# Altium project CM5_RP2040_MZM.PrjPcb (part 1 of 3)
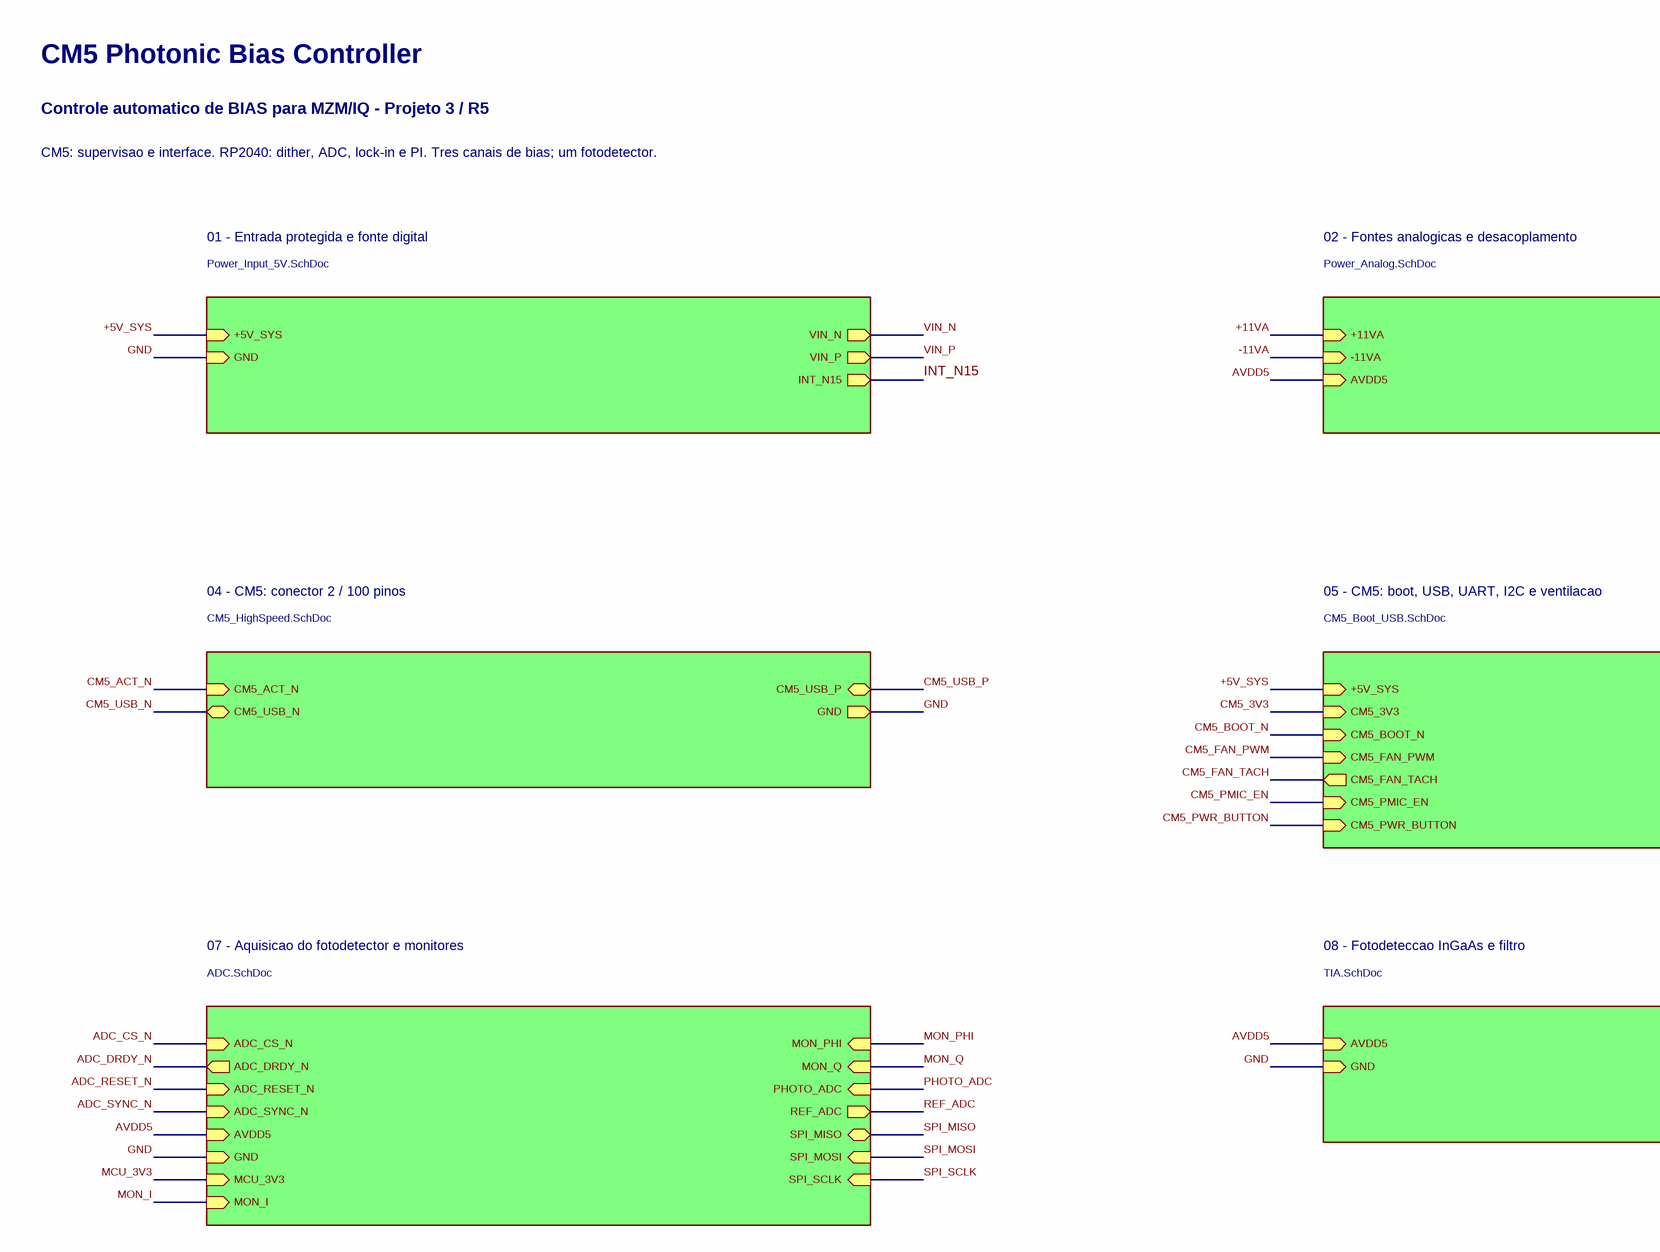
[diagram p0: Top_Level.SchDoc, top left]
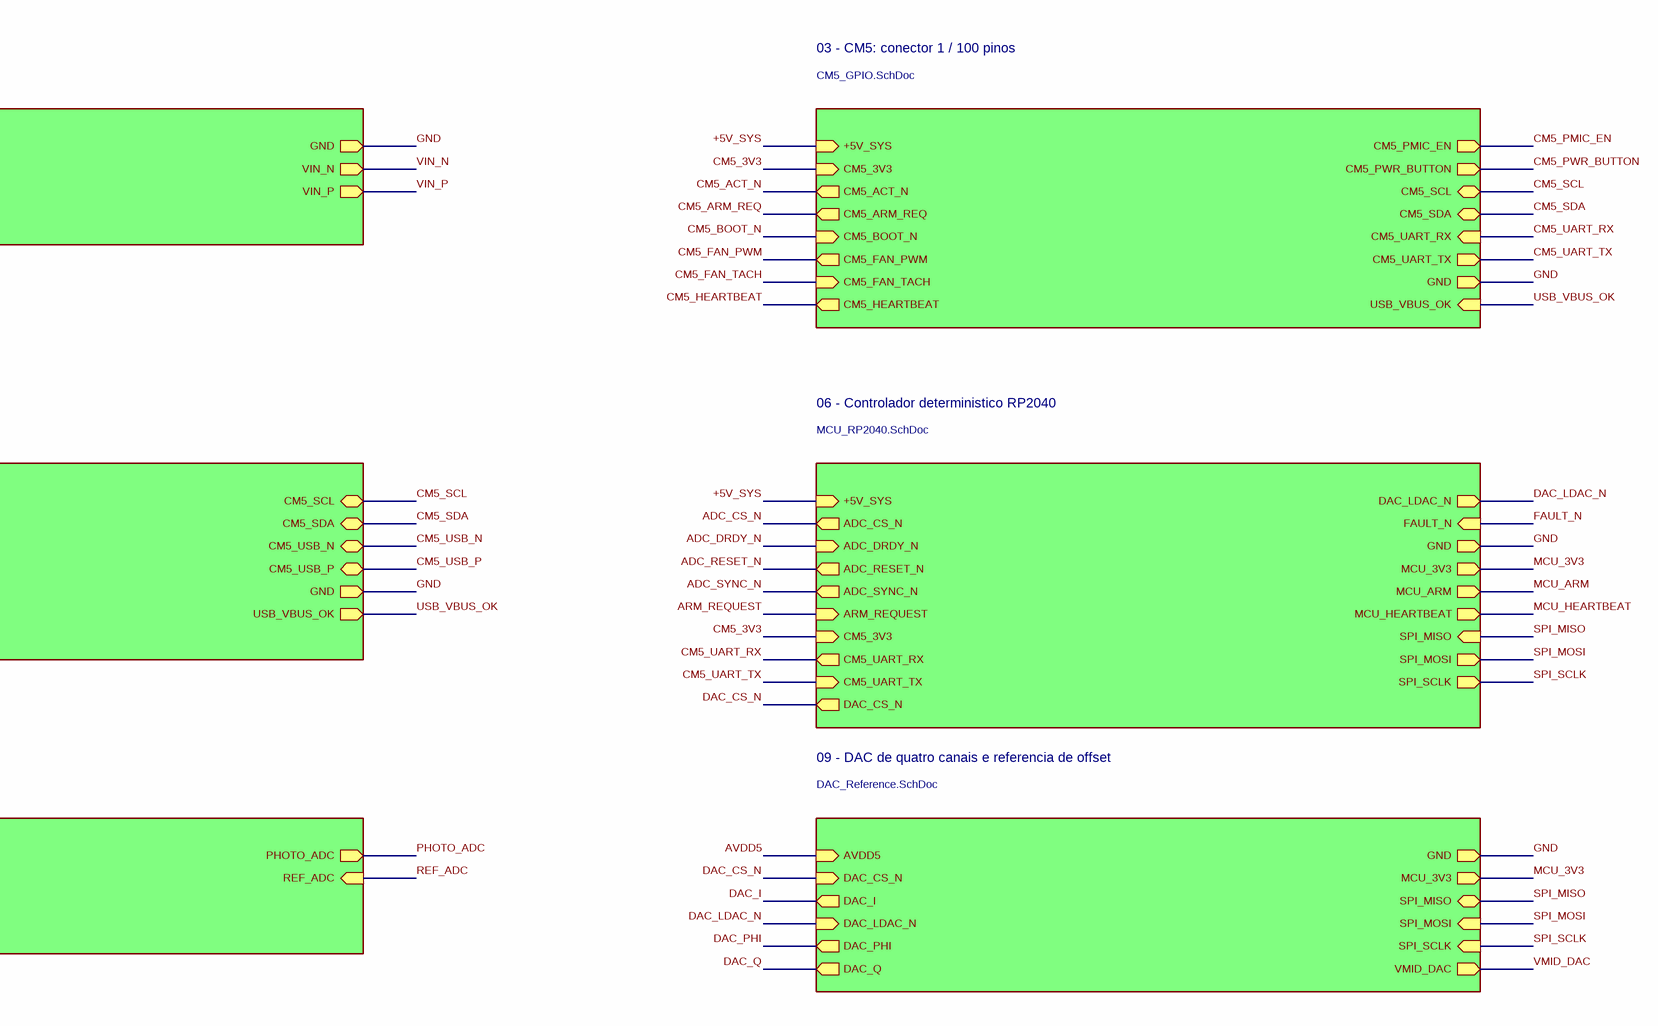
[diagram p1: Top_Level.SchDoc, top right]
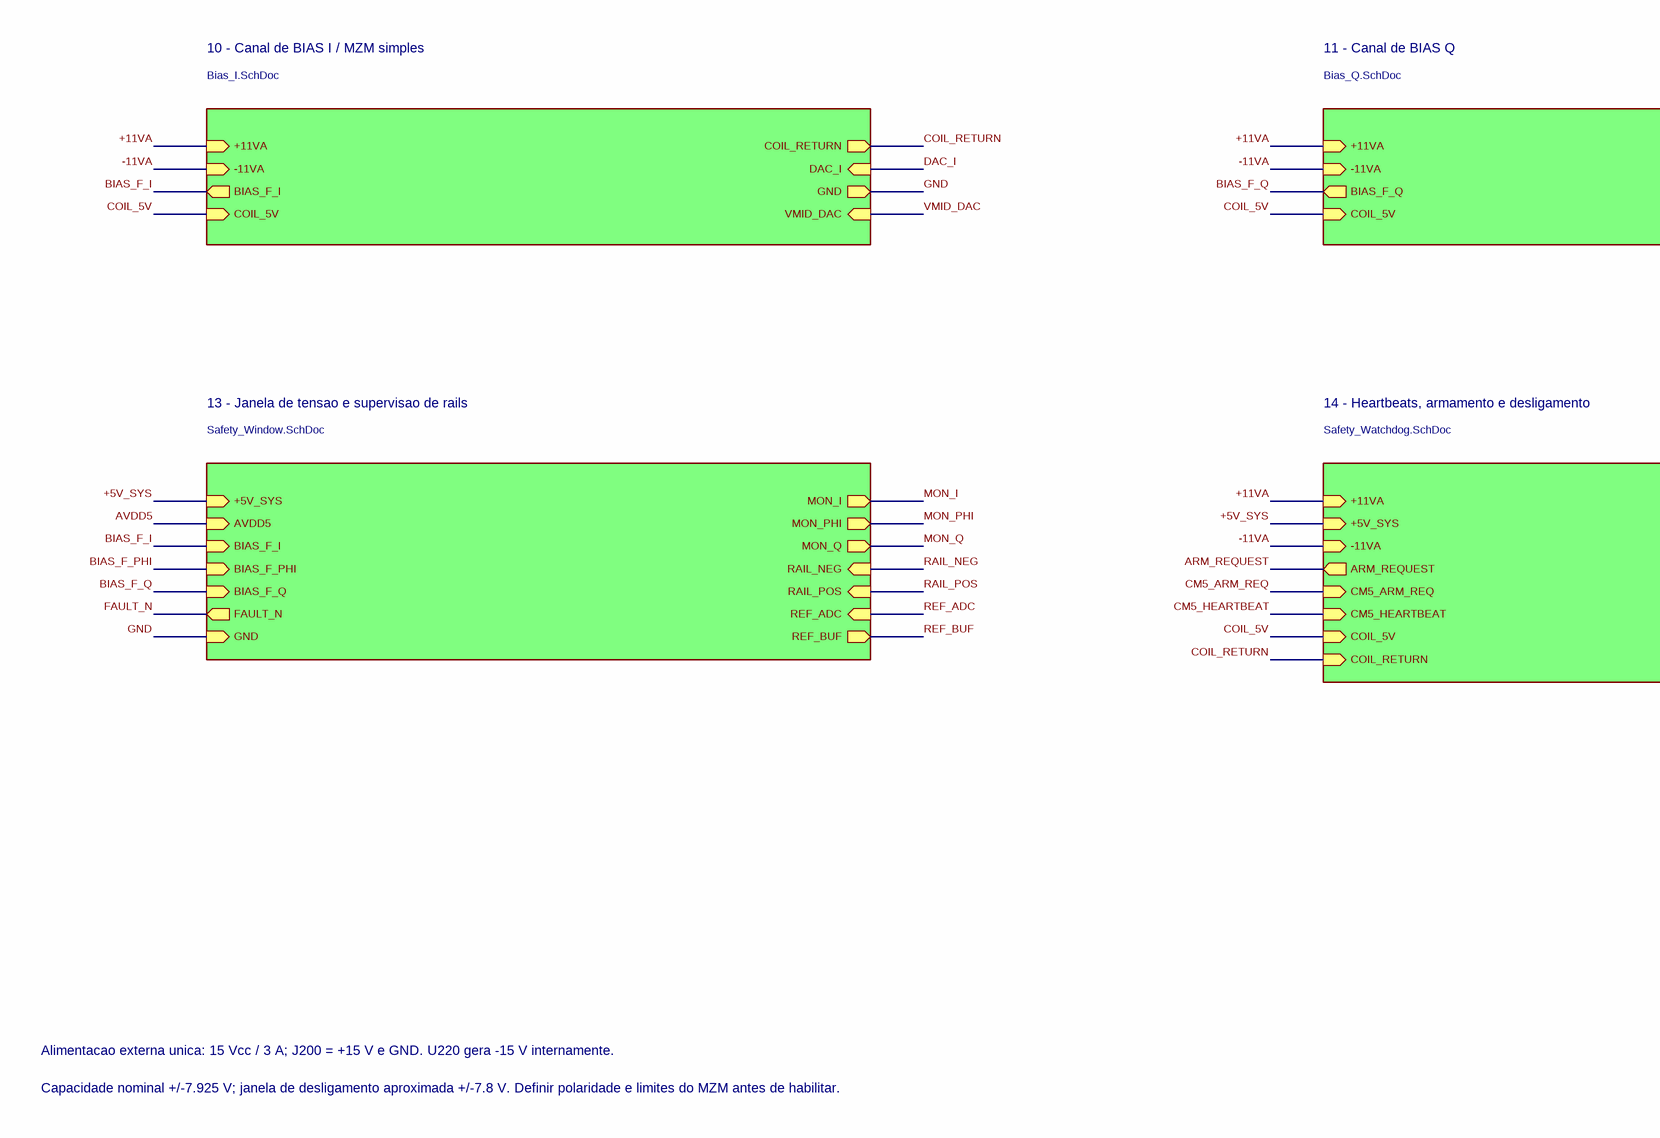
[diagram p2: Top_Level.SchDoc, bottom left]
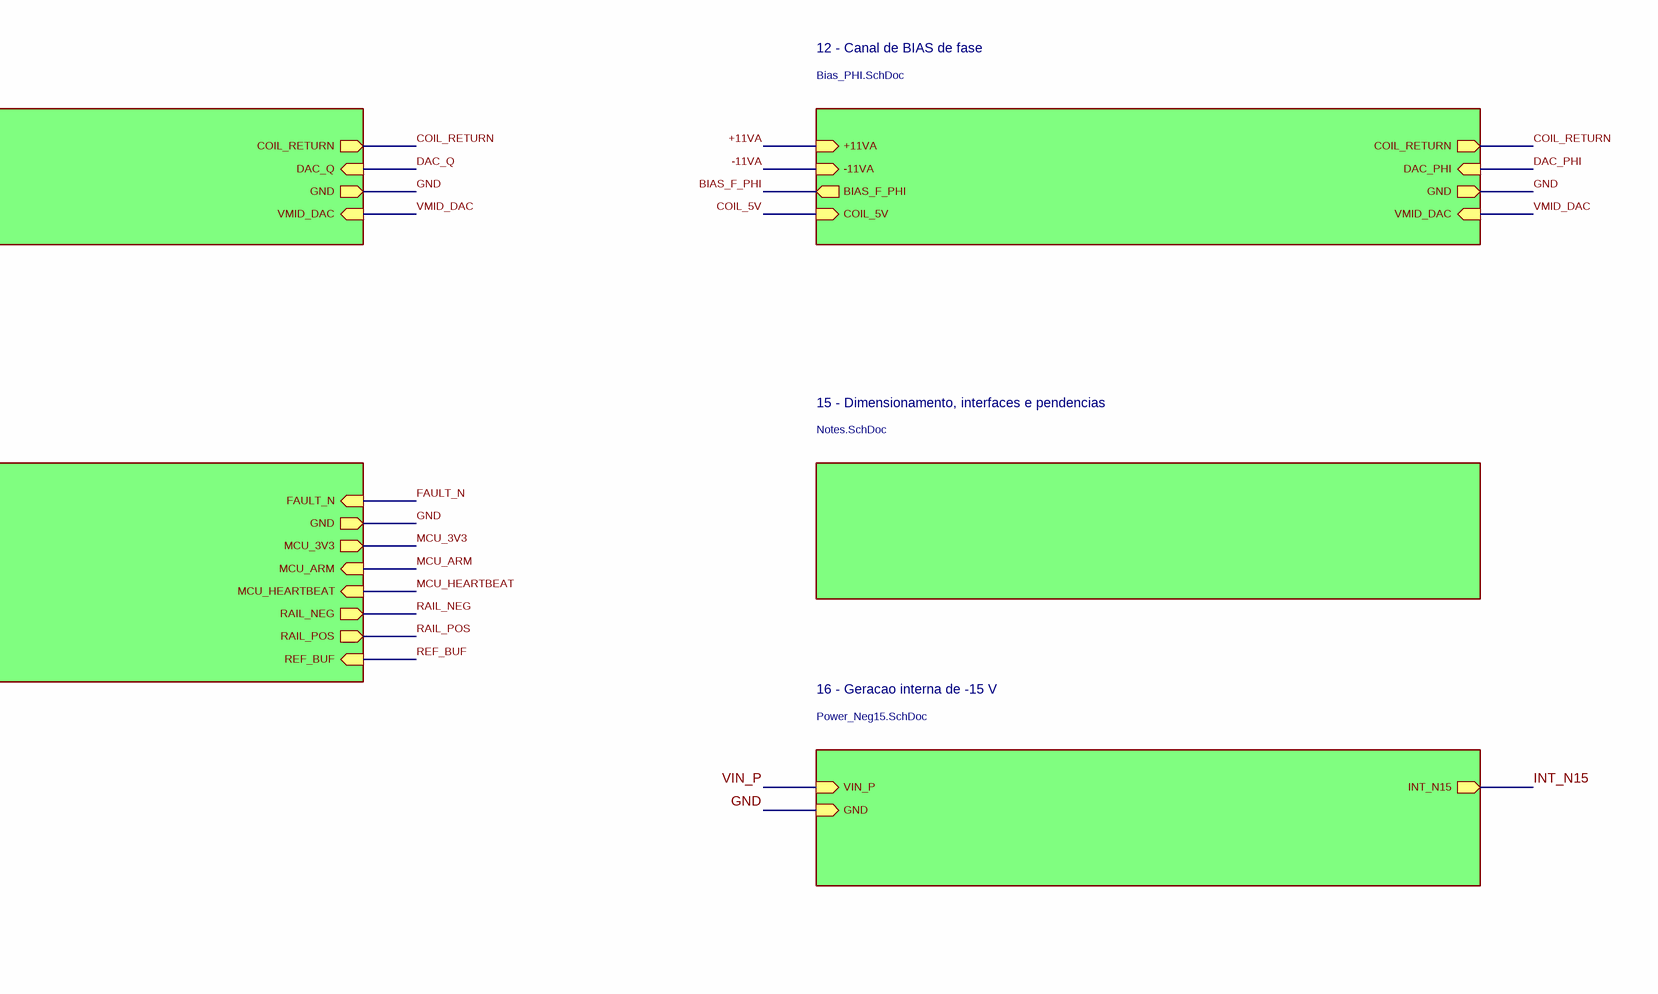
[diagram p3: Top_Level.SchDoc, bottom right]
17 sheets, 219 parts. Net scope: hierarchical (ports join the sheet entries above them; power ports are global).
Board file: CM5_RP2040_MZM.PcbDoc
Sheets:
  Top_Level.SchDoc
    01 - Entrada protegida e fonte digital = Power_Input_5V.SchDoc
    02 - Fontes analogicas e desacoplamento = Power_Analog.SchDoc
    03 - CM5: conector 1 / 100 pinos = CM5_GPIO.SchDoc
    04 - CM5: conector 2 / 100 pinos = CM5_HighSpeed.SchDoc
    05 - CM5: boot, USB, UART, I2C e ventilacao = CM5_Boot_USB.SchDoc
    06 - Controlador deterministico RP2040 = MCU_RP2040.SchDoc
    07 - Aquisicao do fotodetector e monitores = ADC.SchDoc
    08 - Fotodeteccao InGaAs e filtro = TIA.SchDoc
    09 - DAC de quatro canais e referencia de offset = DAC_Reference.SchDoc
    10 - Canal de BIAS I / MZM simples = Bias_I.SchDoc
    11 - Canal de BIAS Q = Bias_Q.SchDoc
    12 - Canal de BIAS de fase = Bias_PHI.SchDoc
    13 - Janela de tensao e supervisao de rails = Safety_Window.SchDoc
    14 - Heartbeats, armamento e desligamento = Safety_Watchdog.SchDoc
    15 - Dimensionamento, interfaces e pendencias = Notes.SchDoc
    16 - Geracao interna de -15 V = Power_Neg15.SchDoc

## Sheet Top_Level.SchDoc: Hierarquia geral / Projeto 3
size 584 x 419 mm; Project: CM5 Photonic Bias Controller; DocumentRev: R5; ProjectRev: R5; Version: Rev R6; SheetNumber: 1; SheetTotal: 17; Author: Carlos Renan; SCH_SCALE: N/A; Address1: UFCG; Address2: Referencia: VIRTUS CC; Address3: Campina Grande - PB; ProjectName: Controle automatico de BIAS para MZM/IQ - Projeto 3; DocumentName: Top_Level.SchDoc

### Sub-sheets
01 - Entrada protegida e fonte digital = Power_Input_5V.SchDoc: +5V_SYS, GND, VIN_N, VIN_P, INT_N15
02 - Fontes analogicas e desacoplamento = Power_Analog.SchDoc: +11VA, -11VA, AVDD5, GND, VIN_N, VIN_P
03 - CM5: conector 1 / 100 pinos = CM5_GPIO.SchDoc: +5V_SYS, CM5_3V3, CM5_ACT_N (out), CM5_ARM_REQ (out), CM5_BOOT_N, CM5_FAN_PWM (out), CM5_FAN_TACH (in), CM5_HEARTBEAT (out), CM5_PMIC_EN, CM5_PWR_BUTTON, CM5_SCL (bidir), CM5_SDA (bidir), CM5_UART_RX (in), CM5_UART_TX (out), GND, USB_VBUS_OK (in)
04 - CM5: conector 2 / 100 pinos = CM5_HighSpeed.SchDoc: CM5_ACT_N (in), CM5_USB_N (bidir), CM5_USB_P (bidir), GND
05 - CM5: boot, USB, UART, I2C e ventilacao = CM5_Boot_USB.SchDoc: +5V_SYS, CM5_3V3, CM5_BOOT_N, CM5_FAN_PWM (in), CM5_FAN_TACH (out), CM5_PMIC_EN, CM5_PWR_BUTTON, CM5_SCL (bidir), CM5_SDA (bidir), CM5_USB_N (bidir), CM5_USB_P (bidir), GND, USB_VBUS_OK (out)
06 - Controlador deterministico RP2040 = MCU_RP2040.SchDoc: +5V_SYS, ADC_CS_N (out), ADC_DRDY_N (in), ADC_RESET_N (out), ADC_SYNC_N (out), ARM_REQUEST (in), CM5_3V3, CM5_UART_RX (out), CM5_UART_TX (in), DAC_CS_N (out), DAC_LDAC_N (out), FAULT_N (in), GND, MCU_3V3, MCU_ARM (out), MCU_HEARTBEAT (out), SPI_MISO (in), SPI_MOSI (out), SPI_SCLK (out)
07 - Aquisicao do fotodetector e monitores = ADC.SchDoc: ADC_CS_N (in), ADC_DRDY_N (out), ADC_RESET_N (in), ADC_SYNC_N (in), AVDD5, GND, MCU_3V3, MON_I (in), MON_PHI (in), MON_Q (in), PHOTO_ADC (in), REF_ADC (out), SPI_MISO (bidir), SPI_MOSI (in), SPI_SCLK (in)
08 - Fotodeteccao InGaAs e filtro = TIA.SchDoc: AVDD5, GND, PHOTO_ADC (out), REF_ADC (in)
09 - DAC de quatro canais e referencia de offset = DAC_Reference.SchDoc: AVDD5, DAC_CS_N (in), DAC_I (out), DAC_LDAC_N (in), DAC_PHI (out), DAC_Q (out), GND, MCU_3V3, SPI_MISO (bidir), SPI_MOSI (in), SPI_SCLK (in), VMID_DAC (out)
10 - Canal de BIAS I / MZM simples = Bias_I.SchDoc: +11VA, -11VA, BIAS_F_I (out), COIL_5V, COIL_RETURN, DAC_I (in), GND, VMID_DAC (in)
11 - Canal de BIAS Q = Bias_Q.SchDoc: +11VA, -11VA, BIAS_F_Q (out), COIL_5V, COIL_RETURN, DAC_Q (in), GND, VMID_DAC (in)
12 - Canal de BIAS de fase = Bias_PHI.SchDoc: +11VA, -11VA, BIAS_F_PHI (out), COIL_5V, COIL_RETURN, DAC_PHI (in), GND, VMID_DAC (in)
13 - Janela de tensao e supervisao de rails = Safety_Window.SchDoc: +5V_SYS, AVDD5, BIAS_F_I (in), BIAS_F_PHI (in), BIAS_F_Q (in), FAULT_N (out), GND, MON_I (out), MON_PHI (out), MON_Q (out), RAIL_NEG (in), RAIL_POS (in), REF_ADC (in), REF_BUF (out)
14 - Heartbeats, armamento e desligamento = Safety_Watchdog.SchDoc: +11VA, +5V_SYS, -11VA, ARM_REQUEST (out), CM5_ARM_REQ (in), CM5_HEARTBEAT (in), COIL_5V, COIL_RETURN, FAULT_N (in), GND, MCU_3V3, MCU_ARM (in), MCU_HEARTBEAT (in), RAIL_NEG (out), RAIL_POS (out), REF_BUF (in)
15 - Dimensionamento, interfaces e pendencias = Notes.SchDoc: no entries
16 - Geracao interna de -15 V = Power_Neg15.SchDoc: VIN_P, GND, INT_N15

### Nets
+11VA: sheet 02 - Fontes analogicas e desacoplamento/+11VA, sheet 10 - Canal de BIAS I / MZM simples/+11VA, sheet 11 - Canal de BIAS Q/+11VA, sheet 12 - Canal de BIAS de fase/+11VA, sheet 14 - Heartbeats, armamento e desligamento/+11VA
AVDD5: sheet 02 - Fontes analogicas e desacoplamento/AVDD5, sheet 07 - Aquisicao do fotodetector e monitores/AVDD5, sheet 08 - Fotodeteccao InGaAs e filtro/AVDD5, sheet 09 - DAC de quatro canais e referencia de offset/AVDD5, sheet 13 - Janela de tensao e supervisao de rails/AVDD5
GND: sheet 01 - Entrada protegida e fonte digital/GND, sheet 02 - Fontes analogicas e desacoplamento/GND, sheet 03 - CM5: conector 1 / 100 pinos/GND, sheet 04 - CM5: conector 2 / 100 pinos/GND, sheet 05 - CM5: boot, USB, UART, I2C e ventilacao/GND, sheet 06 - Controlador deterministico RP2040/GND, sheet 07 - Aquisicao do fotodetector e monitores/GND, sheet 08 - Fotodeteccao InGaAs e filtro/GND, sheet 09 - DAC de quatro canais e referencia de offset/GND, sheet 10 - Canal de BIAS I / MZM simples/GND, sheet 11 - Canal de BIAS Q/GND, sheet 12 - Canal de BIAS de fase/GND, sheet 13 - Janela de tensao e supervisao de rails/GND, sheet 14 - Heartbeats, armamento e desligamento/GND, sheet 16 - Geracao interna de -15 V/GND
+5V_SYS: sheet 01 - Entrada protegida e fonte digital/+5V_SYS, sheet 03 - CM5: conector 1 / 100 pinos/+5V_SYS, sheet 05 - CM5: boot, USB, UART, I2C e ventilacao/+5V_SYS, sheet 06 - Controlador deterministico RP2040/+5V_SYS, sheet 13 - Janela de tensao e supervisao de rails/+5V_SYS, sheet 14 - Heartbeats, armamento e desligamento/+5V_SYS
-11VA: sheet 02 - Fontes analogicas e desacoplamento/-11VA, sheet 10 - Canal de BIAS I / MZM simples/-11VA, sheet 11 - Canal de BIAS Q/-11VA, sheet 12 - Canal de BIAS de fase/-11VA, sheet 14 - Heartbeats, armamento e desligamento/-11VA
ADC_CS_N: sheet 06 - Controlador deterministico RP2040/ADC_CS_N, sheet 07 - Aquisicao do fotodetector e monitores/ADC_CS_N
ADC_DRDY_N: sheet 06 - Controlador deterministico RP2040/ADC_DRDY_N, sheet 07 - Aquisicao do fotodetector e monitores/ADC_DRDY_N
ADC_RESET_N: sheet 06 - Controlador deterministico RP2040/ADC_RESET_N, sheet 07 - Aquisicao do fotodetector e monitores/ADC_RESET_N
ADC_SYNC_N: sheet 06 - Controlador deterministico RP2040/ADC_SYNC_N, sheet 07 - Aquisicao do fotodetector e monitores/ADC_SYNC_N
ARM_REQUEST: sheet 06 - Controlador deterministico RP2040/ARM_REQUEST, sheet 14 - Heartbeats, armamento e desligamento/ARM_REQUEST
BIAS_F_I: sheet 10 - Canal de BIAS I / MZM simples/BIAS_F_I, sheet 13 - Janela de tensao e supervisao de rails/BIAS_F_I
BIAS_F_PHI: sheet 12 - Canal de BIAS de fase/BIAS_F_PHI, sheet 13 - Janela de tensao e supervisao de rails/BIAS_F_PHI
BIAS_F_Q: sheet 11 - Canal de BIAS Q/BIAS_F_Q, sheet 13 - Janela de tensao e supervisao de rails/BIAS_F_Q
CM5_3V3: sheet 03 - CM5: conector 1 / 100 pinos/CM5_3V3, sheet 05 - CM5: boot, USB, UART, I2C e ventilacao/CM5_3V3, sheet 06 - Controlador deterministico RP2040/CM5_3V3
CM5_ACT_N: sheet 03 - CM5: conector 1 / 100 pinos/CM5_ACT_N, sheet 04 - CM5: conector 2 / 100 pinos/CM5_ACT_N
CM5_ARM_REQ: sheet 03 - CM5: conector 1 / 100 pinos/CM5_ARM_REQ, sheet 14 - Heartbeats, armamento e desligamento/CM5_ARM_REQ
CM5_BOOT_N: sheet 03 - CM5: conector 1 / 100 pinos/CM5_BOOT_N, sheet 05 - CM5: boot, USB, UART, I2C e ventilacao/CM5_BOOT_N
CM5_FAN_PWM: sheet 03 - CM5: conector 1 / 100 pinos/CM5_FAN_PWM, sheet 05 - CM5: boot, USB, UART, I2C e ventilacao/CM5_FAN_PWM
CM5_FAN_TACH: sheet 03 - CM5: conector 1 / 100 pinos/CM5_FAN_TACH, sheet 05 - CM5: boot, USB, UART, I2C e ventilacao/CM5_FAN_TACH
CM5_HEARTBEAT: sheet 03 - CM5: conector 1 / 100 pinos/CM5_HEARTBEAT, sheet 14 - Heartbeats, armamento e desligamento/CM5_HEARTBEAT
CM5_PMIC_EN: sheet 03 - CM5: conector 1 / 100 pinos/CM5_PMIC_EN, sheet 05 - CM5: boot, USB, UART, I2C e ventilacao/CM5_PMIC_EN
CM5_PWR_BUTTON: sheet 03 - CM5: conector 1 / 100 pinos/CM5_PWR_BUTTON, sheet 05 - CM5: boot, USB, UART, I2C e ventilacao/CM5_PWR_BUTTON
CM5_SCL: sheet 03 - CM5: conector 1 / 100 pinos/CM5_SCL, sheet 05 - CM5: boot, USB, UART, I2C e ventilacao/CM5_SCL
CM5_SDA: sheet 03 - CM5: conector 1 / 100 pinos/CM5_SDA, sheet 05 - CM5: boot, USB, UART, I2C e ventilacao/CM5_SDA
CM5_UART_RX: sheet 03 - CM5: conector 1 / 100 pinos/CM5_UART_RX, sheet 06 - Controlador deterministico RP2040/CM5_UART_RX
CM5_UART_TX: sheet 03 - CM5: conector 1 / 100 pinos/CM5_UART_TX, sheet 06 - Controlador deterministico RP2040/CM5_UART_TX
CM5_USB_N: sheet 04 - CM5: conector 2 / 100 pinos/CM5_USB_N, sheet 05 - CM5: boot, USB, UART, I2C e ventilacao/CM5_USB_N
CM5_USB_P: sheet 04 - CM5: conector 2 / 100 pinos/CM5_USB_P, sheet 05 - CM5: boot, USB, UART, I2C e ventilacao/CM5_USB_P
COIL_5V: sheet 10 - Canal de BIAS I / MZM simples/COIL_5V, sheet 11 - Canal de BIAS Q/COIL_5V, sheet 12 - Canal de BIAS de fase/COIL_5V, sheet 14 - Heartbeats, armamento e desligamento/COIL_5V
COIL_RETURN: sheet 10 - Canal de BIAS I / MZM simples/COIL_RETURN, sheet 11 - Canal de BIAS Q/COIL_RETURN, sheet 12 - Canal de BIAS de fase/COIL_RETURN, sheet 14 - Heartbeats, armamento e desligamento/COIL_RETURN
DAC_CS_N: sheet 06 - Controlador deterministico RP2040/DAC_CS_N, sheet 09 - DAC de quatro canais e referencia de offset/DAC_CS_N
DAC_I: sheet 09 - DAC de quatro canais e referencia de offset/DAC_I, sheet 10 - Canal de BIAS I / MZM simples/DAC_I
DAC_LDAC_N: sheet 06 - Controlador deterministico RP2040/DAC_LDAC_N, sheet 09 - DAC de quatro canais e referencia de offset/DAC_LDAC_N
DAC_PHI: sheet 09 - DAC de quatro canais e referencia de offset/DAC_PHI, sheet 12 - Canal de BIAS de fase/DAC_PHI
DAC_Q: sheet 09 - DAC de quatro canais e referencia de offset/DAC_Q, sheet 11 - Canal de BIAS Q/DAC_Q
FAULT_N: sheet 06 - Controlador deterministico RP2040/FAULT_N, sheet 13 - Janela de tensao e supervisao de rails/FAULT_N, sheet 14 - Heartbeats, armamento e desligamento/FAULT_N
INT_N15: sheet 01 - Entrada protegida e fonte digital/INT_N15, sheet 16 - Geracao interna de -15 V/INT_N15
MCU_3V3: sheet 06 - Controlador deterministico RP2040/MCU_3V3, sheet 07 - Aquisicao do fotodetector e monitores/MCU_3V3, sheet 09 - DAC de quatro canais e referencia de offset/MCU_3V3, sheet 14 - Heartbeats, armamento e desligamento/MCU_3V3
MCU_ARM: sheet 06 - Controlador deterministico RP2040/MCU_ARM, sheet 14 - Heartbeats, armamento e desligamento/MCU_ARM
MCU_HEARTBEAT: sheet 06 - Controlador deterministico RP2040/MCU_HEARTBEAT, sheet 14 - Heartbeats, armamento e desligamento/MCU_HEARTBEAT
MON_I: sheet 07 - Aquisicao do fotodetector e monitores/MON_I, sheet 13 - Janela de tensao e supervisao de rails/MON_I
MON_PHI: sheet 07 - Aquisicao do fotodetector e monitores/MON_PHI, sheet 13 - Janela de tensao e supervisao de rails/MON_PHI
MON_Q: sheet 07 - Aquisicao do fotodetector e monitores/MON_Q, sheet 13 - Janela de tensao e supervisao de rails/MON_Q
PHOTO_ADC: sheet 07 - Aquisicao do fotodetector e monitores/PHOTO_ADC, sheet 08 - Fotodeteccao InGaAs e filtro/PHOTO_ADC
RAIL_NEG: sheet 13 - Janela de tensao e supervisao de rails/RAIL_NEG, sheet 14 - Heartbeats, armamento e desligamento/RAIL_NEG
RAIL_POS: sheet 13 - Janela de tensao e supervisao de rails/RAIL_POS, sheet 14 - Heartbeats, armamento e desligamento/RAIL_POS
REF_ADC: sheet 07 - Aquisicao do fotodetector e monitores/REF_ADC, sheet 08 - Fotodeteccao InGaAs e filtro/REF_ADC, sheet 13 - Janela de tensao e supervisao de rails/REF_ADC
REF_BUF: sheet 13 - Janela de tensao e supervisao de rails/REF_BUF, sheet 14 - Heartbeats, armamento e desligamento/REF_BUF
SPI_MISO: sheet 06 - Controlador deterministico RP2040/SPI_MISO, sheet 07 - Aquisicao do fotodetector e monitores/SPI_MISO, sheet 09 - DAC de quatro canais e referencia de offset/SPI_MISO
SPI_MOSI: sheet 06 - Controlador deterministico RP2040/SPI_MOSI, sheet 07 - Aquisicao do fotodetector e monitores/SPI_MOSI, sheet 09 - DAC de quatro canais e referencia de offset/SPI_MOSI
SPI_SCLK: sheet 06 - Controlador deterministico RP2040/SPI_SCLK, sheet 07 - Aquisicao do fotodetector e monitores/SPI_SCLK, sheet 09 - DAC de quatro canais e referencia de offset/SPI_SCLK
USB_VBUS_OK: sheet 03 - CM5: conector 1 / 100 pinos/USB_VBUS_OK, sheet 05 - CM5: boot, USB, UART, I2C e ventilacao/USB_VBUS_OK
VIN_N: sheet 01 - Entrada protegida e fonte digital/VIN_N, sheet 02 - Fontes analogicas e desacoplamento/VIN_N
VIN_P: sheet 01 - Entrada protegida e fonte digital/VIN_P, sheet 02 - Fontes analogicas e desacoplamento/VIN_P, sheet 16 - Geracao interna de -15 V/VIN_P
VMID_DAC: sheet 09 - DAC de quatro canais e referencia de offset/VMID_DAC, sheet 10 - Canal de BIAS I / MZM simples/VMID_DAC, sheet 11 - Canal de BIAS Q/VMID_DAC, sheet 12 - Canal de BIAS de fase/VMID_DAC

### Notes on the sheet
- CM5 Photonic Bias Controller
- Controle automatico de BIAS para MZM/IQ - Projeto 3 / R5
- CM5: supervisao e interface. RP2040: dither, ADC, lock-in e PI. Tres canais de bias; um fotodetector.
- Alimentacao externa unica: 15 Vcc / 3 A; J200 = +15 V e GND. U220 gera -15 V internamente.
- Capacidade nominal +/-7.925 V; janela de desligamento aproximada +/-7.8 V. Definir polaridade e limites do MZM antes de habilitar.
- REVISION
- DESCRIPTION
- DATE
- APPROVED
- ADDRESS
- PROJECT
- VERSION
- TITLE
- A2
- SIZE
- SCALE
- DOCUMENT NAME:
- DOCUMENT REVISION:
- OF
- SHEET:
- PROJECT REVISION:

## Sheet Power_Input_5V.SchDoc: 01 - Entrada protegida e fonte digital
size A3; Project: CM5 Photonic Bias Controller; DocumentRev: R5; ProjectRev: R5; Version: Rev R6; SheetNumber: 2; SheetTotal: 17; Author: Carlos Renan; SCH_SCALE: N/A; Address1: UFCG; Address2: Referencia: VIRTUS CC; Address3: Campina Grande - PB; ProjectName: Controle automatico de BIAS para MZM/IQ - Projeto 3; DocumentName: Power_Input_5V.SchDoc
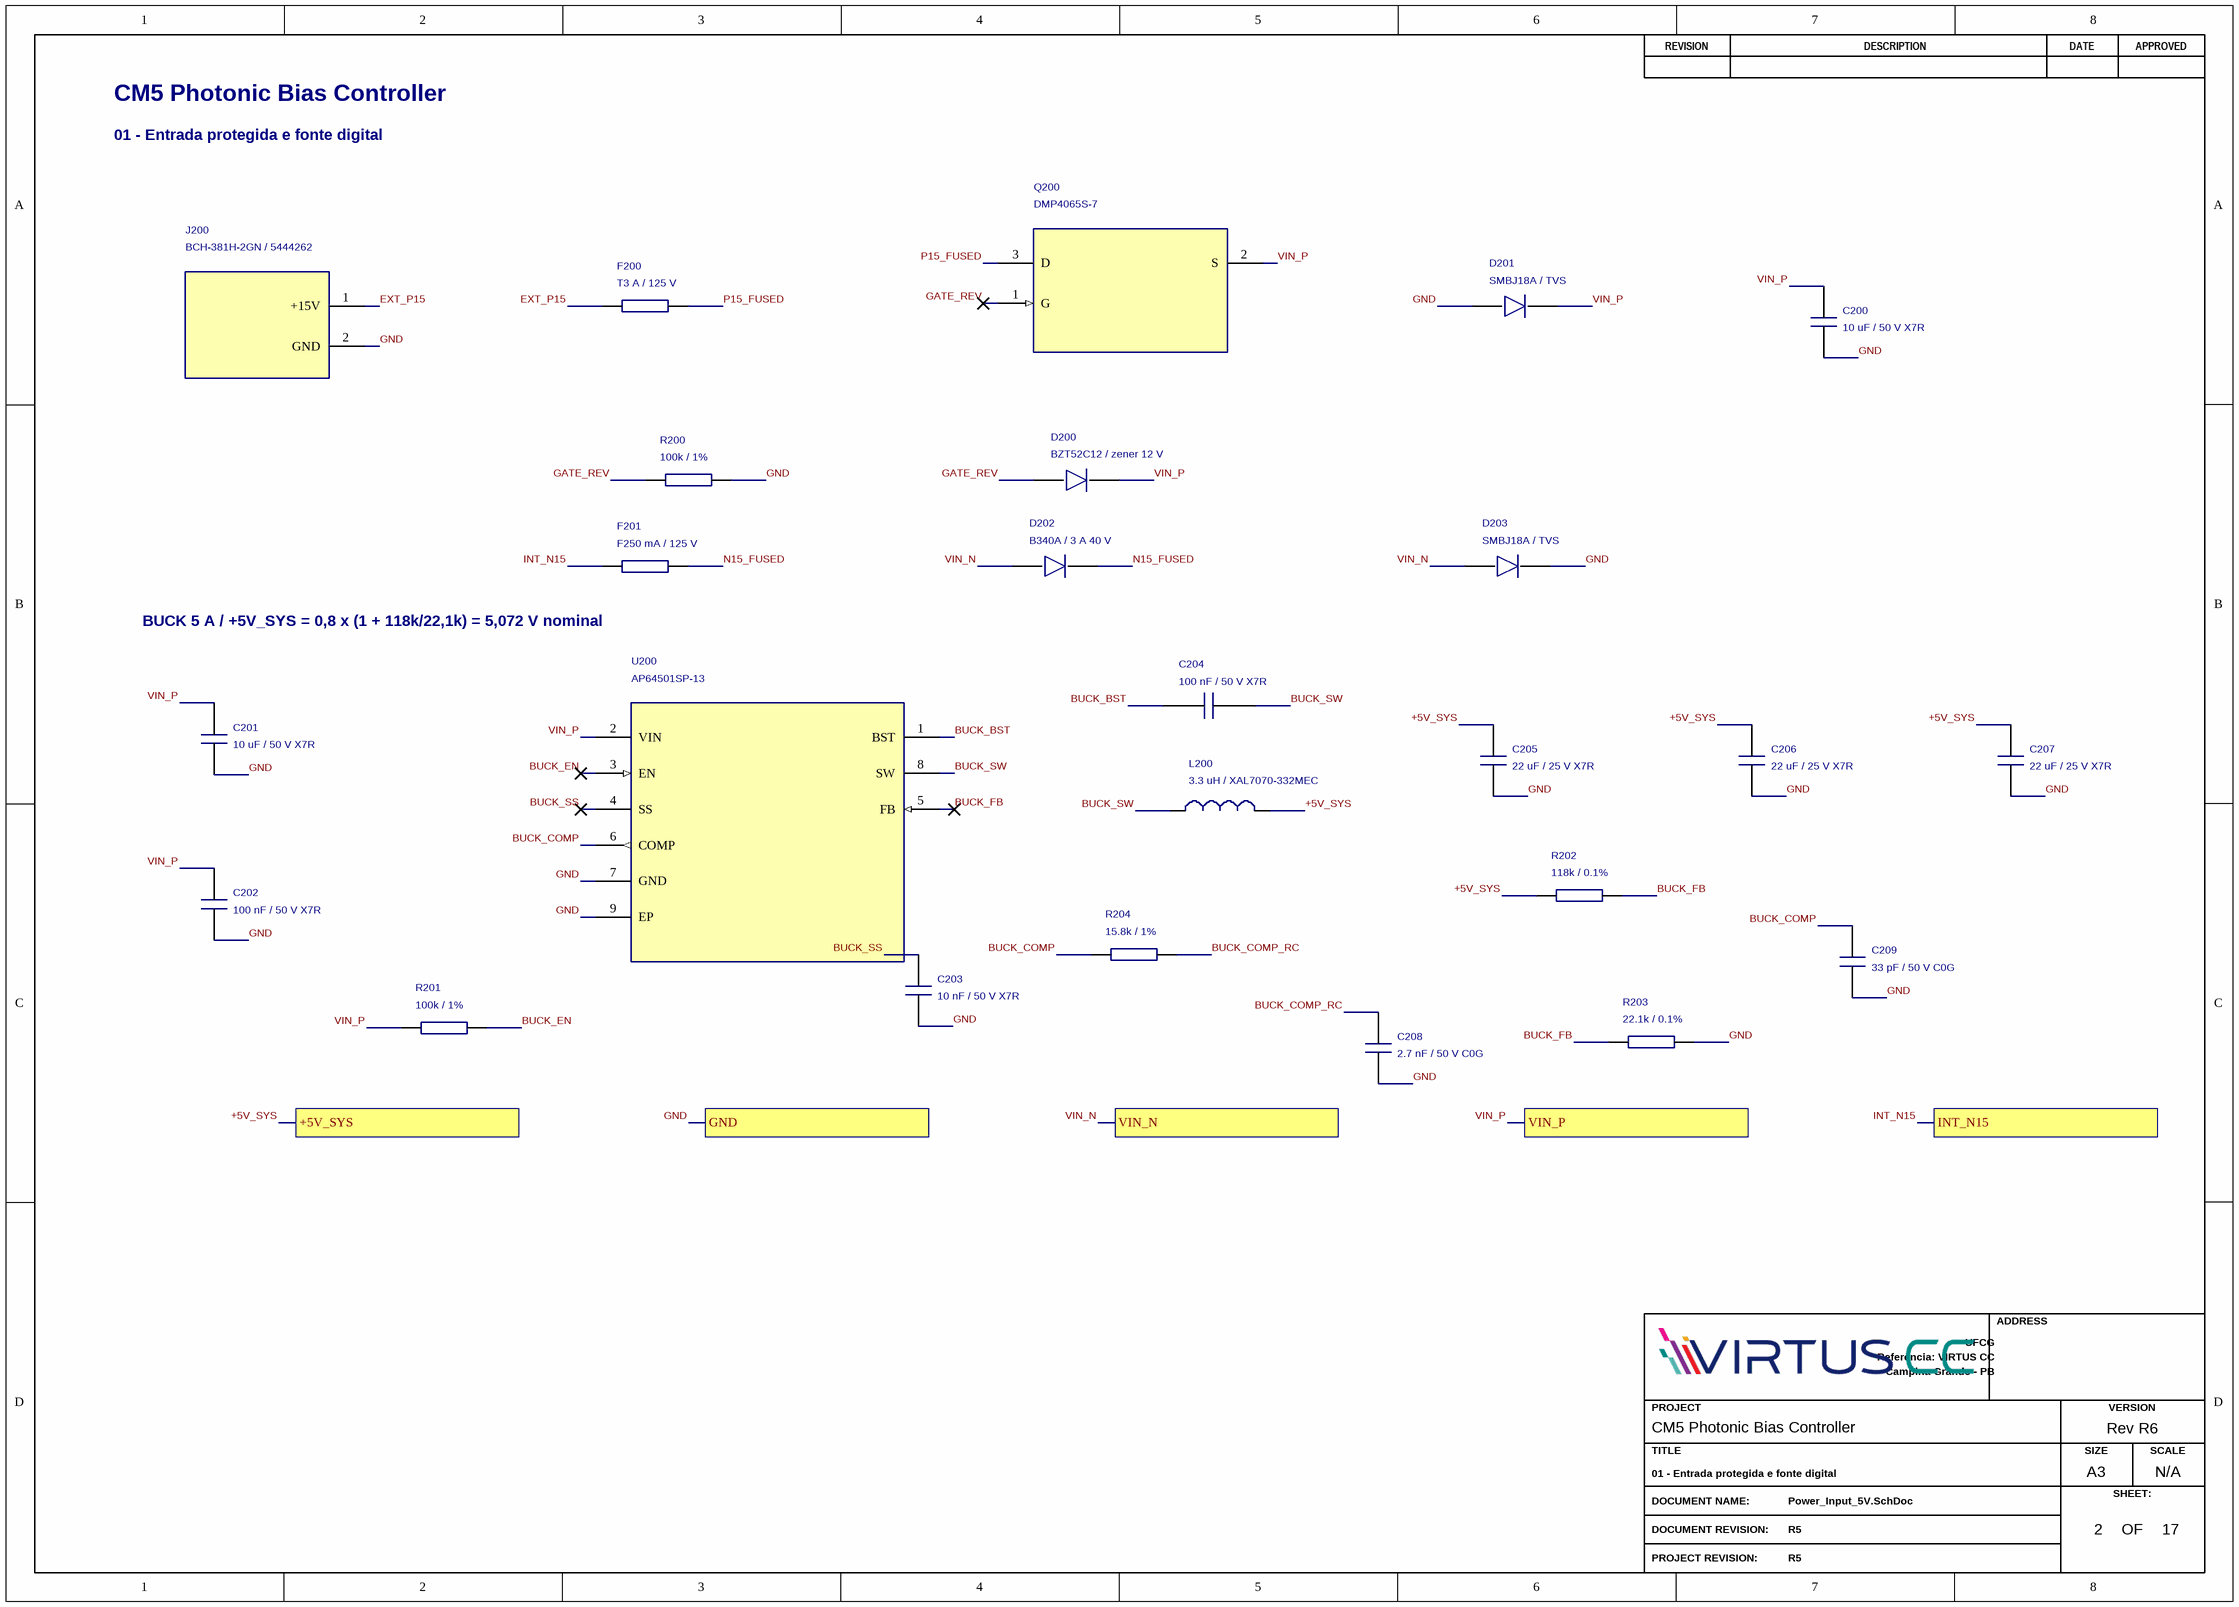
[diagram p4: Power_Input_5V.SchDoc]

### Parts
C200  10 uF / 50 V X7R  [C1210]
C201  10 uF / 50 V X7R  [C1210]
C202  100 nF / 50 V X7R  [C0805]
C203  10 nF / 50 V X7R  [C0805]
C204  100 nF / 50 V X7R  [C0805]
C205  22 uF / 25 V X7R  [C1210]
C206  22 uF / 25 V X7R  [C1210]
C207  22 uF / 25 V X7R  [C1210]
C208  2.7 nF / 50 V C0G  [C0805]
C209  33 pF / 50 V C0G  [C0805]
D200  BZT52C12 / zener 12 V  [SOD-123]
D201  SMBJ18A / TVS  [DO-214AA]
D202  B340A / 3 A 40 V  [DO-214AC]
D203  SMBJ18A / TVS  [DO-214AA]
F200  T3 A / 125 V  [FUSE_NANO2]
F201  F250 mA / 125 V  [FUSE_NANO2]
J200  BCH-381H-2GN / 5444262  [5444262]
L200  3.3 uH / XAL7070-332MEC  [XAL7070]
Q200  DMP4065S-7  [ONSC-SOT-23-3-318-08_V]
R200  100k / 1%  [R-0603]
R201  100k / 1%  [R-0603]
R202  118k / 0.1%  [R-0603]
R203  22.1k / 0.1%  [R-0603]
R204  15.8k / 1%  [R-0603]
U200  AP64501SP-13  [AP64501_SO8EP]

### Ports
+5V_SYS, GND, INT_N15, VIN_N, VIN_P

### Nets
GND: C200.2 C201.2 C202.2 C203.2 C205.2 C206.2 C207.2 C208.2 C209.2 D201.2(A) D203.1(K) J200.2(GND) R200.2 R203.2 U200.7(GND) U200.9(EP) ; port GND
+5V_SYS: C205.1 C206.1 C207.1 L200.2 R202.1 ; port +5V_SYS
BUCK_BST: C204.1 U200.1(BST)
BUCK_COMP: C209.1 R204.1 U200.6(COMP)
BUCK_COMP_RC: C208.1 R204.2
BUCK_EN: R201.2 U200.3(EN)
BUCK_FB: R202.2 R203.1 U200.5(FB)
BUCK_SS: C203.1 U200.4(SS)
BUCK_SW: C204.2 L200.1 U200.8(SW)
EXT_P15: F200.1 J200.1(+15V)
GATE_REV: D200.2(A) Q200.1(G) R200.1
INT_N15: F201.1 ; port INT_N15
N15_FUSED: D202.1(K) F201.2
P15_FUSED: F200.2 Q200.3(D)
VIN_N: D202.2(A) D203.2(A) ; port VIN_N
VIN_P: C200.1 C201.1 C202.1 D200.1(K) D201.1(K) Q200.2(S) R201.1 U200.2(VIN) ; port VIN_P

### Notes on the sheet
- CM5 Photonic Bias Controller
- 01 - Entrada protegida e fonte digital
- (near F201) BUCK 5 A / +5V_SYS = 0,8 x (1 + 118k/22,1k) = 5,072 V nominal
- REVISION
- DESCRIPTION
- DATE
- APPROVED
- ADDRESS
- PROJECT
- VERSION
- TITLE
- A3
- SIZE
- SCALE
- DOCUMENT NAME:
- DOCUMENT REVISION:
- OF
- SHEET:
- PROJECT REVISION:

### Library data of the parts
C200 = 22 uF: Manufacturer: KEMET; Manufacturer Part Number: C1210C106K5RACTU; Review: 10 uF/50 V + C201 de 10 uF substituem a combinacao generica 22+10 uF na entrada; verificar ripple/inrush.; Procurement Status: Busca por MPN; SKU e disponibilidade a confirmar; BOM Purchase: Yes; Manufacturer 1: KEMET; Manufacturer Part Number 1: C1210C106K5RACTU; Supplier 1: DigiKey; Supplier URL 1: https://www.digikey.com.br/pt/products/result?keywords=C1210C106K5RACTU; Supplier 2: Mouser; Supplier URL 2: https://br.mouser.com/c/?q=C1210C106K5RACTU; Datasheet: https://www.yageogroup.com/download/specsheet/C1210C106K5RACTU
C201 = 10 uF: Manufacturer: KEMET; Manufacturer Part Number: C1210C106K5RACTU; Procurement Status: Busca por MPN; SKU e disponibilidade a confirmar; BOM Purchase: Yes; Manufacturer 1: KEMET; Manufacturer Part Number 1: C1210C106K5RACTU; Supplier 1: DigiKey; Supplier URL 1: https://www.digikey.com.br/pt/products/result?keywords=C1210C106K5RACTU; Supplier 2: Mouser; Supplier URL 2: https://br.mouser.com/c/?q=C1210C106K5RACTU; Datasheet: https://www.yageogroup.com/download/specsheet/C1210C106K5RACTU
C202 C204 = 100 nF: Manufacturer: KEMET; Manufacturer Part Number: C0805C104K5RACTU; Procurement Status: Busca por MPN; SKU e disponibilidade a confirmar; BOM Purchase: Yes; Manufacturer 1: KEMET; Manufacturer Part Number 1: C0805C104K5RACTU; Supplier 1: DigiKey; Supplier URL 1: https://www.digikey.com.br/pt/products/result?keywords=C0805C104K5RACTU; Supplier 2: Mouser; Supplier URL 2: https://br.mouser.com/c/?q=C0805C104K5RACTU; Datasheet: https://www.yageogroup.com/download/specsheet/C0805C104K5RACTU
C203 = 10 nF: Manufacturer: KEMET; Manufacturer Part Number: C0805C103K5RACTU; Procurement Status: Busca por MPN; SKU e disponibilidade a confirmar; BOM Purchase: Yes; Manufacturer 1: KEMET; Manufacturer Part Number 1: C0805C103K5RACTU; Supplier 1: DigiKey; Supplier URL 1: https://www.digikey.com.br/pt/products/result?keywords=C0805C103K5RACTU; Supplier 2: Mouser; Supplier URL 2: https://br.mouser.com/c/?q=C0805C103K5RACTU; Datasheet: https://www.yageogroup.com/download/specsheet/C0805C103K5RACTU
C205-C207 = 22 uF: Manufacturer: KEMET; Manufacturer Part Number: C1210C226K3RACTU; Review: Confirmar curva DC-bias: meta de >=50 uF efetivos no conjunto a 5,1 V; compensacao do buck ainda requer ensaio.; Procurement Status: SKU conferido; consultar disponibilidade; BOM Purchase: Yes; Manufacturer 1: KEMET; Manufacturer Part Number 1: C1210C226K3RACTU; Supplier 1: DigiKey; Supplier Part Number 1: 399-C1210C226K3RACTUCT-ND; Supplier URL 1: https://www.digikey.com/en/products/detail/kemet/C1210C226K3RACTU/5267618; Supplier 2: Mouser; Supplier URL 2: https://br.mouser.com/c/?q=C1210C226K3RACTU; Datasheet: https://www.yageogroup.com/download/specsheet/C1210C226K3RACTU
C208 = 2.7 nF: Manufacturer: KEMET; Manufacturer Part Number: C0805C272J5GACTU; Procurement Status: Busca por MPN; SKU e disponibilidade a confirmar; BOM Purchase: Yes; Manufacturer 1: KEMET; Manufacturer Part Number 1: C0805C272J5GACTU; Supplier 1: DigiKey; Supplier URL 1: https://www.digikey.com.br/pt/products/result?keywords=C0805C272J5GACTU; Supplier 2: Mouser; Supplier URL 2: https://br.mouser.com/c/?q=C0805C272J5GACTU; Datasheet: https://www.yageogroup.com/download/specsheet/C0805C272J5GACTU
C209 = 33 pF: Manufacturer: KEMET; Manufacturer Part Number: C0805C330J5GACTU; Procurement Status: Busca por MPN; SKU e disponibilidade a confirmar; BOM Purchase: Yes; Manufacturer 1: KEMET; Manufacturer Part Number 1: C0805C330J5GACTU; Supplier 1: DigiKey; Supplier URL 1: https://www.digikey.com.br/pt/products/result?keywords=C0805C330J5GACTU; Supplier 2: Mouser; Supplier URL 2: https://br.mouser.com/c/?q=C0805C330J5GACTU; Datasheet: https://www.yageogroup.com/download/specsheet/C0805C330J5GACTU
D200 = BZT52C12: Manufacturer: Diodes Incorporated; Manufacturer Part Number: BZT52C12-7-F; Procurement Status: Busca por MPN; SKU e disponibilidade a confirmar; BOM Purchase: Yes; Manufacturer 1: Diodes Incorporated; Manufacturer Part Number 1: BZT52C12-7-F; Supplier 1: DigiKey; Supplier URL 1: https://www.digikey.com.br/pt/products/result?keywords=BZT52C12-7-F; Supplier 2: Mouser; Supplier URL 2: https://br.mouser.com/c/?q=BZT52C12-7-F; Datasheet: https://www.diodes.com/datasheet/download/BZT52C2V4.pdf
D201 D203 = SMBJ18A: Manufacturer: Diodes Incorporated; Manufacturer Part Number: SMBJ18A-13-F; Procurement Status: Busca por MPN; SKU e disponibilidade a confirmar; BOM Purchase: Yes; Manufacturer 1: Diodes Incorporated; Manufacturer Part Number 1: SMBJ18A-13-F; Supplier 1: DigiKey; Supplier URL 1: https://www.digikey.com.br/pt/products/result?keywords=SMBJ18A-13-F; Supplier 2: Mouser; Supplier URL 2: https://br.mouser.com/c/?q=SMBJ18A-13-F; Datasheet: https://www.diodes.com/datasheet/download/SMBJ5.0A.pdf
D202 = SS34: Manufacturer: Diodes Incorporated; Manufacturer Part Number: B340A-13-F; Review: Substitui SS34 generico; encapsulamento SMA definido pelo fabricante.; Procurement Status: Busca por MPN; SKU e disponibilidade a confirmar; BOM Purchase: Yes; Manufacturer 1: Diodes Incorporated; Manufacturer Part Number 1: B340A-13-F; Supplier 1: DigiKey; Supplier URL 1: https://www.digikey.com.br/pt/products/result?keywords=B340A-13-F; Supplier 2: Mouser; Supplier URL 2: https://br.mouser.com/c/?q=B340A-13-F; Datasheet: https://www.diodes.com/datasheet/download/B340A.pdf
F200 = T3.15A: Manufacturer: Littelfuse; Manufacturer Part Number: 0452003.MRL; Review: 3 A lento no lugar do 3,15 A generico. Verificar inrush e coordenacao com fonte de bancada.; Procurement Status: SKU conferido; consultar disponibilidade; BOM Purchase: Yes; Manufacturer 1: Littelfuse; Manufacturer Part Number 1: 0452003.MRL; Supplier 1: DigiKey; Supplier Part Number 1: F2604CT-ND; Supplier URL 1: https://www.digikey.com/en/products/detail/littelfuse-inc/0452003-MRL/700840; Supplier 2: Mouser; Supplier URL 2: https://br.mouser.com/c/?q=0452003.MRL; Datasheet: https://www.littelfuse.com/~/media/electronics/datasheets/fuses/littelfuse_fuse_452_454_datasheet.pdf.pdf
F201 = Fusivel T250mA: Manufacturer: Littelfuse; Manufacturer Part Number: 0451.250MRL; Review: 250 mA rapido; a serie 452 nao oferece 250 mA. Validar pulso de partida do ramo negativo.; Procurement Status: SKU conferido; consultar disponibilidade; BOM Purchase: Yes; Manufacturer 1: Littelfuse; Manufacturer Part Number 1: 0451.250MRL; Supplier 1: DigiKey; Supplier Part Number 1: F2572CT-ND; Supplier URL 1: https://www.digikey.com/en/products/detail/littelfuse-inc/0451-250MRL/700810; Supplier 2: Mouser; Supplier URL 2: https://br.mouser.com/c/?q=0451.250MRL; Datasheet: https://www.littelfuse.com/~/media/electronics/datasheets/fuses/littelfuse_fuse_451_453_datasheet.pdf.pdf
J200 = Borne 2 vias: Manufacturer: Phoenix Contact; Procurement Status: Busca por MPN; SKU e disponibilidade a confirmar; BOM Purchase: Yes; Manufacturer Part Number: 5444262; Manufacturer 1: Phoenix Contact; Manufacturer Part Number 1: 5444262; Supplier 1: DigiKey; Supplier URL 1: https://www.digikey.com.br/pt/products/result?keywords=5444262; Supplier 2: Mouser; Supplier URL 2: https://br.mouser.com/c/?q=5444262; Datasheet: https://www.phoenixcontact.com/en-ie/products/pcb-header-bch-381h-2-gn-5444262
L200 = 3.3 uH: Manufacturer: Coilcraft; Review: 3,3 uH +/-20%; DCR max 9,42 mOhm; Isat 19,4 A (queda 30%); verificar compensacao e termica do buck.; Procurement Status: Busca por MPN; SKU e disponibilidade a confirmar; BOM Purchase: Yes; Manufacturer Part Number: XAL7070-332MEC; Manufacturer 1: Coilcraft; Manufacturer Part Number 1: XAL7070-332MEC; Supplier 1: DigiKey; Supplier URL 1: https://www.digikey.com.br/pt/products/result?keywords=XAL7070-332MEC; Supplier 2: Mouser; Supplier URL 2: https://br.mouser.com/c/?q=XAL7070-332MEC; Datasheet: https://www.coilcraft.com/getmedia/1ba55433-bcc8-4838-9b21-382f497e12e0/xal7070.pdf
Q200 = DMP4065S-7: Manufacturer: Diodes Incorporated; Procurement Status: Busca por MPN; SKU e disponibilidade a confirmar; BOM Purchase: Yes; Manufacturer Part Number: DMP4065S-7; Manufacturer 1: Diodes Incorporated; Manufacturer Part Number 1: DMP4065S-7; Supplier 1: DigiKey; Supplier URL 1: https://www.digikey.com.br/pt/products/result?keywords=DMP4065S-7; Supplier 2: Mouser; Supplier URL 2: https://br.mouser.com/c/?q=DMP4065S-7; Datasheet: https://www.diodes.com/datasheet/download/DMP4065S.pdf
R200 R201 = 100k: Manufacturer: YAGEO; Manufacturer Part Number: RC0603FR-07100KL; Procurement Status: Busca por MPN; SKU e disponibilidade a confirmar; BOM Purchase: Yes; Manufacturer 1: YAGEO; Manufacturer Part Number 1: RC0603FR-07100KL; Supplier 1: DigiKey; Supplier URL 1: https://www.digikey.com.br/pt/products/result?keywords=RC0603FR-07100KL; Supplier 2: Mouser; Supplier URL 2: https://br.mouser.com/c/?q=RC0603FR-07100KL; Datasheet: https://www.yageo.com/en/Product/Index/rchip
R202 = 118k: Manufacturer: YAGEO; Manufacturer Part Number: RT0603BRD07118KL; Review: Filme fino, 0,1%, 25 ppm/K; 0,1 W. Verificar dissipacao em R210/R212 e matching dos drivers.; Procurement Status: Busca por MPN; SKU e disponibilidade a confirmar; BOM Purchase: Yes; Manufacturer 1: YAGEO; Manufacturer Part Number 1: RT0603BRD07118KL; Supplier 1: DigiKey; Supplier URL 1: https://www.digikey.com.br/pt/products/result?keywords=RT0603BRD07118KL; Supplier 2: Mouser; Supplier URL 2: https://br.mouser.com/c/?q=RT0603BRD07118KL; Datasheet: https://www.yageo.com/en/Product/Index/rchip
R203 = 22.1k: Manufacturer: YAGEO; Manufacturer Part Number: RT0603BRD0722K1L; Review: Filme fino, 0,1%, 25 ppm/K; 0,1 W. Verificar dissipacao em R210/R212 e matching dos drivers.; Procurement Status: Busca por MPN; SKU e disponibilidade a confirmar; BOM Purchase: Yes; Manufacturer 1: YAGEO; Manufacturer Part Number 1: RT0603BRD0722K1L; Supplier 1: DigiKey; Supplier URL 1: https://www.digikey.com.br/pt/products/result?keywords=RT0603BRD0722K1L; Supplier 2: Mouser; Supplier URL 2: https://br.mouser.com/c/?q=RT0603BRD0722K1L; Datasheet: https://www.yageo.com/en/Product/Index/rchip
R204 = 15.8k: Manufacturer: YAGEO; Manufacturer Part Number: RC0603FR-0715K8L; Procurement Status: Busca por MPN; SKU e disponibilidade a confirmar; BOM Purchase: Yes; Manufacturer 1: YAGEO; Manufacturer Part Number 1: RC0603FR-0715K8L; Supplier 1: DigiKey; Supplier URL 1: https://www.digikey.com.br/pt/products/result?keywords=RC0603FR-0715K8L; Supplier 2: Mouser; Supplier URL 2: https://br.mouser.com/c/?q=RC0603FR-0715K8L; Datasheet: https://www.yageo.com/en/Product/Index/rchip
U200 = AP64501SP-13: Manufacturer: Diodes Incorporated; Procurement Status: Busca por MPN; SKU e disponibilidade a confirmar; BOM Purchase: Yes; Manufacturer Part Number: AP64501SP-13; Manufacturer 1: Diodes Incorporated; Manufacturer Part Number 1: AP64501SP-13; Supplier 1: DigiKey; Supplier URL 1: https://www.digikey.com.br/pt/products/result?keywords=AP64501SP-13; Supplier 2: Mouser; Supplier URL 2: https://br.mouser.com/c/?q=AP64501SP-13; Datasheet: https://www.diodes.com/datasheet/download/AP64501.pdf

## Sheet Power_Analog.SchDoc: 02 - Fontes analogicas e desacoplamento
size A3; Project: CM5 Photonic Bias Controller; DocumentRev: R5; ProjectRev: R5; Version: Rev R6; SheetNumber: 3; SheetTotal: 17; Author: Carlos Renan; SCH_SCALE: N/A; Address1: UFCG; Address2: Referencia: VIRTUS CC; Address3: Campina Grande - PB; ProjectName: Controle automatico de BIAS para MZM/IQ - Projeto 3; DocumentName: Power_Analog.SchDoc
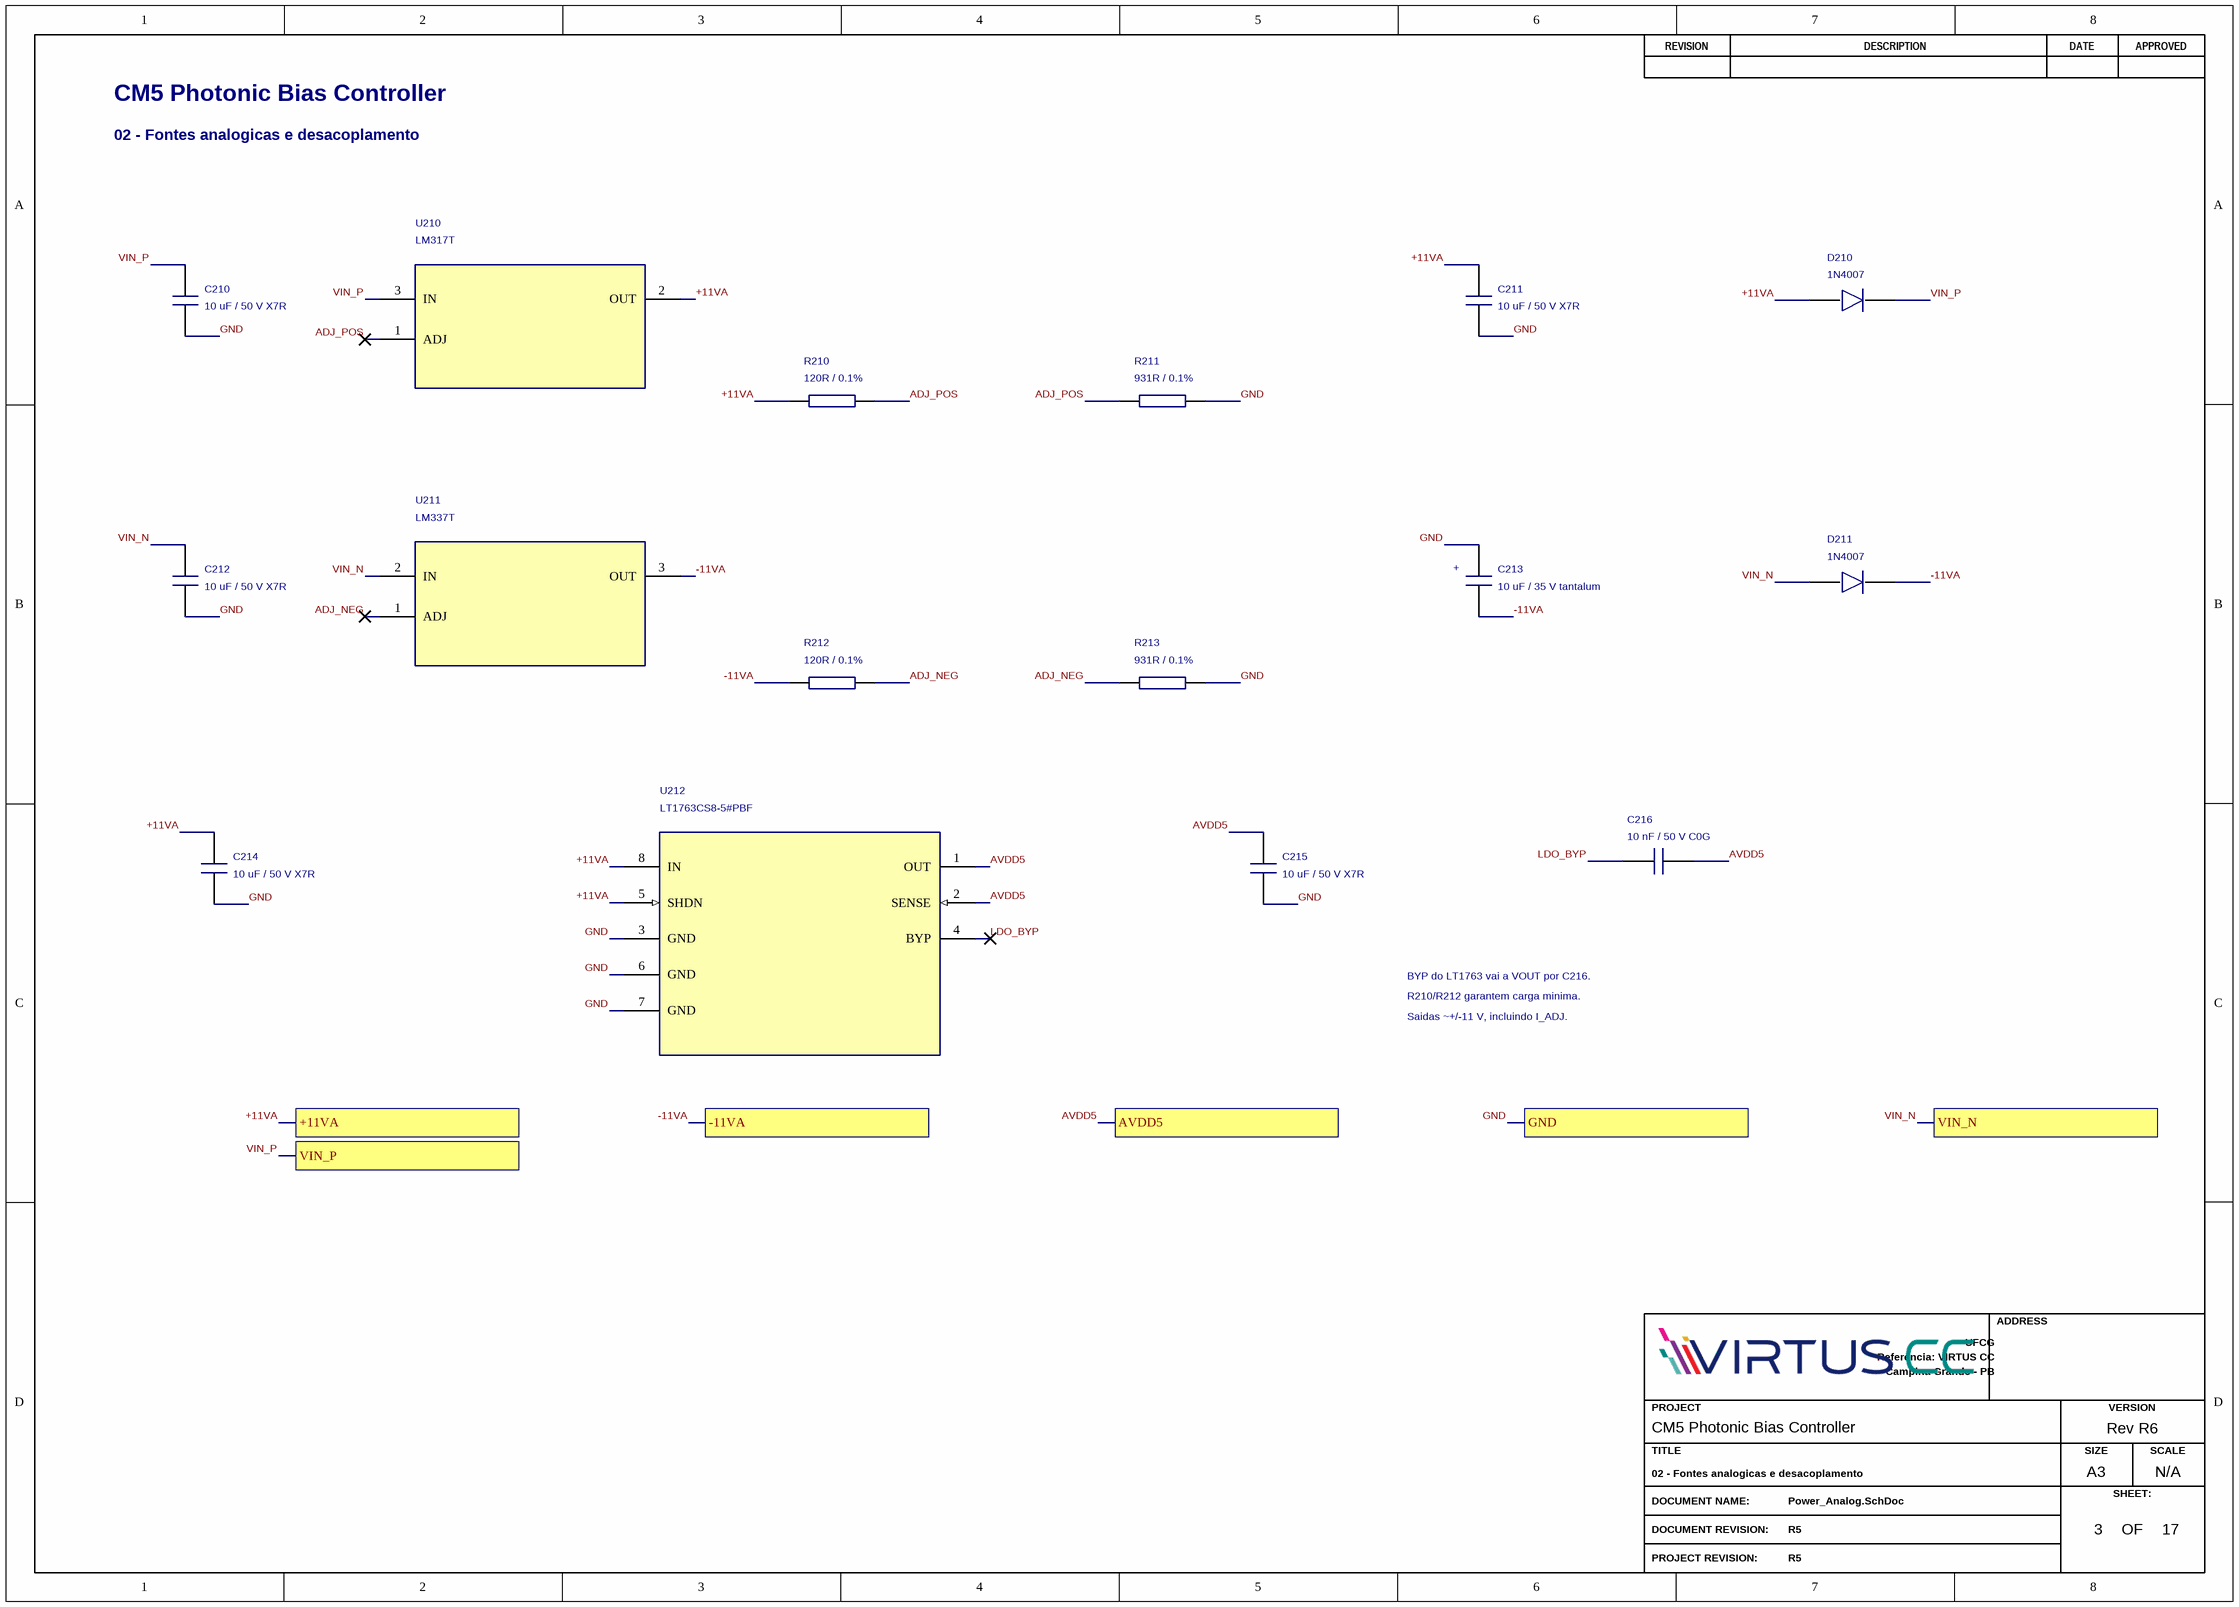
[diagram p5: Power_Analog.SchDoc]

### Parts
C210  10 uF / 50 V X7R  [C1210]
C211  10 uF / 50 V X7R  [C1210]
C212  10 uF / 50 V X7R  [C1210]
C213  10 uF / 35 V tantalum  [TANT_D]
C214  10 uF / 50 V X7R  [C1210]
C215  10 uF / 50 V X7R  [C1210]
C216  10 nF / 50 V C0G  [C0805]
D210  1N4007  [D_DO41_P10]
D211  1N4007  [D_DO41_P10]
R210  120R / 0.1%  [R-0603]
R211  931R / 0.1%  [R-0603]
R212  120R / 0.1%  [R-0603]
R213  931R / 0.1%  [R-0603]
U210  LM317T  [TO220_3]
U211  LM337T  [TO220_3]
U212  LT1763CS8-5#PBF  [SOIC8]

### Ports
+11VA, -11VA, AVDD5, GND, VIN_N, VIN_P

### Nets
+11VA: C211.1 C214.1 D210.2(A) R210.1 U210.2(OUT) U212.5(SHDN) U212.8(IN) ; port +11VA
AVDD5: C215.1 C216.2 U212.1(OUT) U212.2(SENSE) ; port AVDD5
GND: C210.2 C211.2 C212.2 C213.1 C214.2 C215.2 R211.2 R213.2 U212.3(GND) U212.6(GND) U212.7(GND) ; port GND
-11VA: C213.2 D211.1(K) R212.1 U211.3(OUT) ; port -11VA
ADJ_NEG: R212.2 R213.1 U211.1(ADJ)
ADJ_POS: R210.2 R211.1 U210.1(ADJ)
LDO_BYP: C216.1 U212.4(BYP)
VIN_N: C212.1 D211.2(A) U211.2(IN) ; port VIN_N
VIN_P: C210.1 D210.1(K) U210.3(IN) ; port VIN_P

### Notes on the sheet
- CM5 Photonic Bias Controller
- 02 - Fontes analogicas e desacoplamento
- BYP do LT1763 vai a VOUT por C216.
- R210/R212 garantem carga minima.
- Saidas ~+/-11 V, incluindo I_ADJ.
- REVISION
- DESCRIPTION
- DATE
- APPROVED
- ADDRESS
- PROJECT
- VERSION
- TITLE
- A3
- SIZE
- SCALE
- DOCUMENT NAME:
- DOCUMENT REVISION:
- OF
- SHEET:
- PROJECT REVISION:
- (in symbol 10 uF) +

### Library data of the parts
C210-C212 C214 C215 = 10 uF: as C201 on sheet Power_Input_5V; Manufacturer 1: KEMET; Manufacturer Part Number 1: C1210C106K5RACTU; Supplier 1: DigiKey; Supplier URL 1: https://www.digikey.com.br/pt/products/result?keywords=C1210C106K5RACTU; Supplier 2: Mouser; Supplier URL 2: https://br.mouser.com/c/?q=C1210C106K5RACTU; Datasheet: https://www.yageogroup.com/download/specsheet/C1210C106K5RACTU
C213 = 10 uF: Manufacturer: KEMET; Manufacturer Part Number: T491D106K035AT; Review: Tantalo caso D; positivo pad 1 ao GND, negativo pad 2 a -11VA; ESR max 3 ohm.; Procurement Status: Busca por MPN; SKU e disponibilidade a confirmar; BOM Purchase: Yes; Manufacturer 1: KEMET; Manufacturer Part Number 1: T491D106K035AT; Supplier 1: DigiKey; Supplier URL 1: https://www.digikey.com.br/pt/products/result?keywords=T491D106K035AT; Supplier 2: Mouser; Supplier URL 2: https://br.mouser.com/c/?q=T491D106K035AT; Datasheet: https://www.yageogroup.com/download/specsheet/T491D106K035AT
C216 = 10 nF: Manufacturer: KEMET; Manufacturer Part Number: C0805C103J5GACTU; Procurement Status: Busca por MPN; SKU e disponibilidade a confirmar; BOM Purchase: Yes; Manufacturer 1: KEMET; Manufacturer Part Number 1: C0805C103J5GACTU; Supplier 1: DigiKey; Supplier URL 1: https://www.digikey.com.br/pt/products/result?keywords=C0805C103J5GACTU; Supplier 2: Mouser; Supplier URL 2: https://br.mouser.com/c/?q=C0805C103J5GACTU; Datasheet: https://www.yageogroup.com/download/specsheet/C0805C103J5GACTU
D210 D211 = 1N4007: Manufacturer: Vishay; Manufacturer Part Number: 1N4007-E3/54; Procurement Status: Busca por MPN; SKU e disponibilidade a confirmar; BOM Purchase: Yes; Manufacturer 1: Vishay; Manufacturer Part Number 1: 1N4007-E3/54; Supplier 1: DigiKey; Supplier URL 1: https://www.digikey.com.br/pt/products/result?keywords=1N4007-E3%2F54; Supplier 2: Mouser; Supplier URL 2: https://br.mouser.com/c/?q=1N4007-E3%2F54; Datasheet: https://www.vishay.com/docs/88503/1n4001.pdf
R210 R212 = 120R: Manufacturer: YAGEO; Manufacturer Part Number: RT0603BRD07120RL; Review: Filme fino, 0,1%, 25 ppm/K; 0,1 W. Verificar dissipacao em R210/R212 e matching dos drivers.; Procurement Status: Busca por MPN; SKU e disponibilidade a confirmar; BOM Purchase: Yes; Manufacturer 1: YAGEO; Manufacturer Part Number 1: RT0603BRD07120RL; Supplier 1: DigiKey; Supplier URL 1: https://www.digikey.com.br/pt/products/result?keywords=RT0603BRD07120RL; Supplier 2: Mouser; Supplier URL 2: https://br.mouser.com/c/?q=RT0603BRD07120RL; Datasheet: https://www.yageo.com/en/Product/Index/rchip
R211 R213 = 931R: Manufacturer: YAGEO; Manufacturer Part Number: RT0603BRD07931RL; Review: Filme fino, 0,1%, 25 ppm/K; 0,1 W. Verificar dissipacao em R210/R212 e matching dos drivers.; Procurement Status: Busca por MPN; SKU e disponibilidade a confirmar; BOM Purchase: Yes; Manufacturer 1: YAGEO; Manufacturer Part Number 1: RT0603BRD07931RL; Supplier 1: DigiKey; Supplier URL 1: https://www.digikey.com.br/pt/products/result?keywords=RT0603BRD07931RL; Supplier 2: Mouser; Supplier URL 2: https://br.mouser.com/c/?q=RT0603BRD07931RL; Datasheet: https://www.yageo.com/en/Product/Index/rchip
U210 = LM317T: Manufacturer: STMicroelectronics; Procurement Status: Busca por MPN; SKU e disponibilidade a confirmar; BOM Purchase: Yes; Manufacturer Part Number: LM317T; Manufacturer 1: STMicroelectronics; Manufacturer Part Number 1: LM317T; Supplier 1: DigiKey; Supplier URL 1: https://www.digikey.com.br/pt/products/result?keywords=LM317T; Supplier 2: Mouser; Supplier URL 2: https://br.mouser.com/c/?q=LM317T; Datasheet: https://www.st.com/resource/en/datasheet/lm317.pdf
U211 = LM337T: Manufacturer: STMicroelectronics; Procurement Status: Busca por MPN; SKU e disponibilidade a confirmar; BOM Purchase: Yes; Manufacturer Part Number: LM337T; Manufacturer 1: STMicroelectronics; Manufacturer Part Number 1: LM337T; Supplier 1: DigiKey; Supplier URL 1: https://www.digikey.com.br/pt/products/result?keywords=LM337T; Supplier 2: Mouser; Supplier URL 2: https://br.mouser.com/c/?q=LM337T; Datasheet: https://www.st.com/resource/en/datasheet/lm337.pdf
U212 = LT1763CS8-5#PBF: Manufacturer: Analog Devices; Procurement Status: Busca por MPN; SKU e disponibilidade a confirmar; BOM Purchase: Yes; Manufacturer Part Number: LT1763CS8-5#PBF; Manufacturer 1: Analog Devices; Manufacturer Part Number 1: LT1763CS8-5#PBF; Supplier 1: DigiKey; Supplier URL 1: https://www.digikey.com.br/pt/products/result?keywords=LT1763CS8-5%23PBF; Supplier 2: Mouser; Supplier URL 2: https://br.mouser.com/c/?q=LT1763CS8-5%23PBF; Datasheet: https://www.analog.com/media/en/technical-documentation/data-sheets/1763fg.pdf

## Sheet CM5_GPIO.SchDoc: 03 - CM5: conector 1 / 100 pinos
size A3; Project: CM5 Photonic Bias Controller; DocumentRev: R5; ProjectRev: R5; Version: Rev R6; SheetNumber: 4; SheetTotal: 17; Author: Carlos Renan; SCH_SCALE: N/A; Address1: UFCG; Address2: Referencia: VIRTUS CC; Address3: Campina Grande - PB; ProjectName: Controle automatico de BIAS para MZM/IQ - Projeto 3; DocumentName: CM5_GPIO.SchDoc
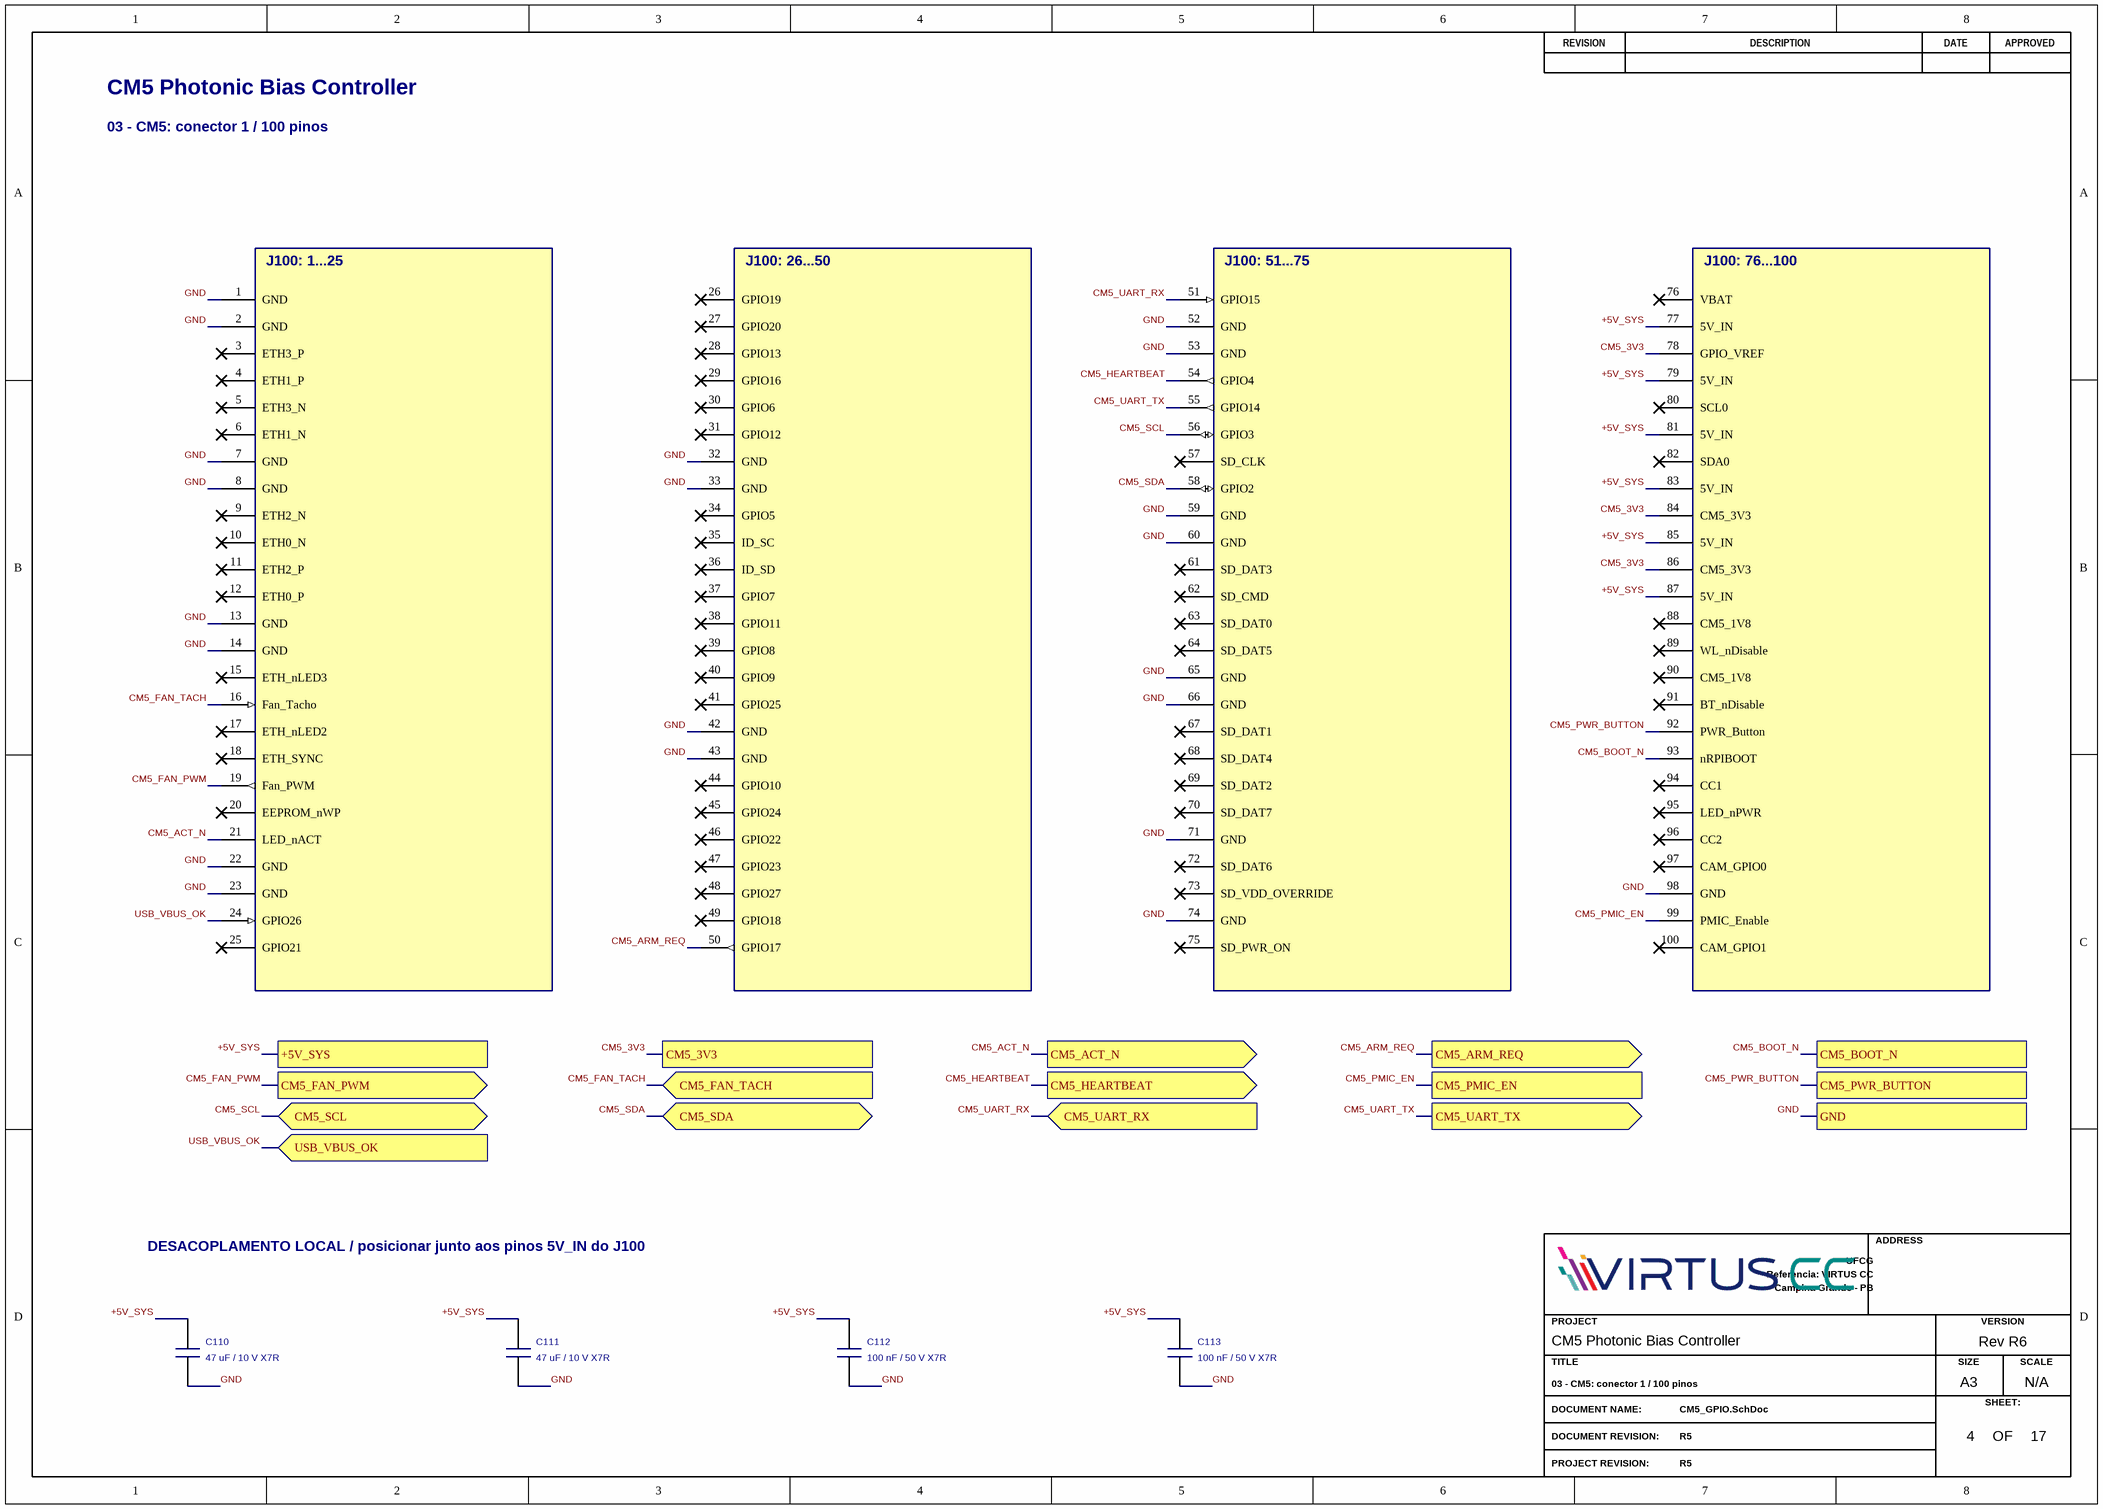
[diagram p6: CM5_GPIO.SchDoc]

### Parts
C110  47 uF / 10 V X7R  [C1210]
C111  47 uF / 10 V X7R  [C1210]
C112  100 nF / 50 V X7R  [C0805]
C113  100 nF / 50 V X7R  [C0805]
J100  CM5 carrier / 100 vias  [CM5_BERG100]  (value not drawn)

### Ports
+5V_SYS, CM5_3V3, CM5_ACT_N (out), CM5_ARM_REQ (out), CM5_BOOT_N, CM5_FAN_PWM (out), CM5_FAN_TACH (in), CM5_HEARTBEAT (out), CM5_PMIC_EN, CM5_PWR_BUTTON, CM5_SCL (bidir), CM5_SDA (bidir), CM5_UART_RX (in), CM5_UART_TX (out), GND, USB_VBUS_OK (in)

### Nets
GND: C110.2 C111.2 C112.2 C113.2 J100.1(GND) J100.2(GND) J100.7(GND) J100.8(GND) J100.13(GND) J100.14(GND) J100.22(GND) J100.23(GND) J100.32(GND) J100.33(GND) J100.42(GND) J100.43(GND) J100.52(GND) J100.53(GND) J100.59(GND) J100.60(GND) J100.65(GND) J100.66(GND) J100.71(GND) J100.74(GND) J100.98(GND) ; port GND
+5V_SYS: C110.1 C111.1 C112.1 C113.1 J100.77(5V_IN) J100.79(5V_IN) J100.81(5V_IN) J100.83(5V_IN) J100.85(5V_IN) J100.87(5V_IN) ; port +5V_SYS
CM5_3V3: J100.78(GPIO_VREF) J100.84(CM5_3V3) J100.86(CM5_3V3) ; port CM5_3V3
CM5_ACT_N: J100.21(LED_nACT) ; port CM5_ACT_N
CM5_ARM_REQ: J100.50(GPIO17) ; port CM5_ARM_REQ
CM5_BOOT_N: J100.93(nRPIBOOT) ; port CM5_BOOT_N
CM5_FAN_PWM: J100.19(Fan_PWM) ; port CM5_FAN_PWM
CM5_FAN_TACH: J100.16(Fan_Tacho) ; port CM5_FAN_TACH
CM5_HEARTBEAT: J100.54(GPIO4) ; port CM5_HEARTBEAT
CM5_PMIC_EN: J100.99(PMIC_Enable) ; port CM5_PMIC_EN
CM5_PWR_BUTTON: J100.92(PWR_Button) ; port CM5_PWR_BUTTON
CM5_SCL: J100.56(GPIO3) ; port CM5_SCL
CM5_SDA: J100.58(GPIO2) ; port CM5_SDA
CM5_UART_RX: J100.51(GPIO15) ; port CM5_UART_RX
CM5_UART_TX: J100.55(GPIO14) ; port CM5_UART_TX
USB_VBUS_OK: J100.24(GPIO26) ; port USB_VBUS_OK

Not connected (* = marked no-connect by the designer): J100 3(ETH3_P)* 4(ETH1_P)* 5(ETH3_N)* 6(ETH1_N)* 9(ETH2_N)* 10(ETH0_N)* 11(ETH2_P)* 12(ETH0_P)* 15(ETH_nLED3)* 17(ETH_nLED2)* 18(ETH_SYNC)* 20(EEPROM_nWP)* 25(GPIO21)* 26(GPIO19)* 27(GPIO20)* 28(GPIO13)* 29(GPIO16)* 30(GPIO6)* 31(GPIO12)* 34(GPIO5)* 35(ID_SC)* 36(ID_SD)* 37(GPIO7)* 38(GPIO11)* 39(GPIO8)* 40(GPIO9)* 41(GPIO25)* 44(GPIO10)* 45(GPIO24)* 46(GPIO22)* 47(GPIO23)* 48(GPIO27)* 49(GPIO18)* 57(SD_CLK)* 61(SD_DAT3)* 62(SD_CMD)* 63(SD_DAT0)* 64(SD_DAT5)* 67(SD_DAT1)* 68(SD_DAT4)* 69(SD_DAT2)* 70(SD_DAT7)* 72(SD_DAT6)* 73(SD_VDD_OVERRIDE)* 75(SD_PWR_ON)* 76(VBAT)* 80(SCL0)* 82(SDA0)* 88(CM5_1V8)* 89(WL_nDisable)* 90(CM5_1V8)* 91(BT_nDisable)* 94(CC1)* 95(LED_nPWR)* 96(CC2)* 97(CAM_GPIO0)* 100(CAM_GPIO1)*

### Notes on the sheet
- CM5 Photonic Bias Controller
- 03 - CM5: conector 1 / 100 pinos
- DESACOPLAMENTO LOCAL / posicionar junto aos pinos 5V_IN do J100
- REVISION
- DESCRIPTION
- DATE
- APPROVED
- ADDRESS
- PROJECT
- VERSION
- TITLE
- A3
- SIZE
- SCALE
- DOCUMENT NAME:
- DOCUMENT REVISION:
- OF
- SHEET:
- PROJECT REVISION:
- (in symbol CM5 carrier) J100: 1...25; J100: 26...50; J100: 51...75; J100: 76...100

### Library data of the parts
C110 C111 = 47 uF: Manufacturer: Murata; Manufacturer Part Number: GRM32ER71A476KE15L; Procurement Status: Busca por MPN; SKU e disponibilidade a confirmar; BOM Purchase: Yes; Manufacturer 1: Murata; Manufacturer Part Number 1: GRM32ER71A476KE15L; Supplier 1: DigiKey; Supplier URL 1: https://www.digikey.com.br/pt/products/result?keywords=GRM32ER71A476KE15L; Supplier 2: Mouser; Supplier URL 2: https://br.mouser.com/c/?q=GRM32ER71A476KE15L; Datasheet: https://www.murata.com/en-us/products/productdetail?partno=GRM32ER71A476KE15L
C112 C113 = 100 nF: as C202 on sheet Power_Input_5V; Manufacturer 1: KEMET; Manufacturer Part Number 1: C0805C104K5RACTU; Supplier 1: DigiKey; Supplier URL 1: https://www.digikey.com.br/pt/products/result?keywords=C0805C104K5RACTU; Supplier 2: Mouser; Supplier URL 2: https://br.mouser.com/c/?q=C0805C104K5RACTU; Datasheet: https://www.yageogroup.com/download/specsheet/C0805C104K5RACTU
J100 = CM5 carrier: Manufacturer: Amphenol Communications Solutions; Manufacturer Part Number: 10164227-1004A1RLF; Review: 100 vias, passo 0,4 mm, empilhamento 4 mm. Pads locais 1..100; J101 corresponde aos pinos globais 101..200.; Procurement Status: Busca por MPN; SKU e disponibilidade a confirmar; BOM Purchase: Yes; Manufacturer 1: Amphenol Communications Solutions; Manufacturer Part Number 1: 10164227-1004A1RLF; Supplier 1: DigiKey; Supplier URL 1: https://www.digikey.com.br/pt/products/result?keywords=10164227-1004A1RLF; Supplier 2: Mouser; Supplier URL 2: https://br.mouser.com/c/?q=10164227-1004A1RLF; Datasheet: https://cdn.amphenol-cs.com/media/wysiwyg/files/drawing/10164227.pdf

## Sheet CM5_HighSpeed.SchDoc: 04 - CM5: conector 2 / 100 pinos
size A3; Project: CM5 Photonic Bias Controller; DocumentRev: R5; ProjectRev: R5; Version: Rev R6; SheetNumber: 5; SheetTotal: 17; Author: Carlos Renan; SCH_SCALE: N/A; Address1: UFCG; Address2: Referencia: VIRTUS CC; Address3: Campina Grande - PB; ProjectName: Controle automatico de BIAS para MZM/IQ - Projeto 3; DocumentName: CM5_HighSpeed.SchDoc
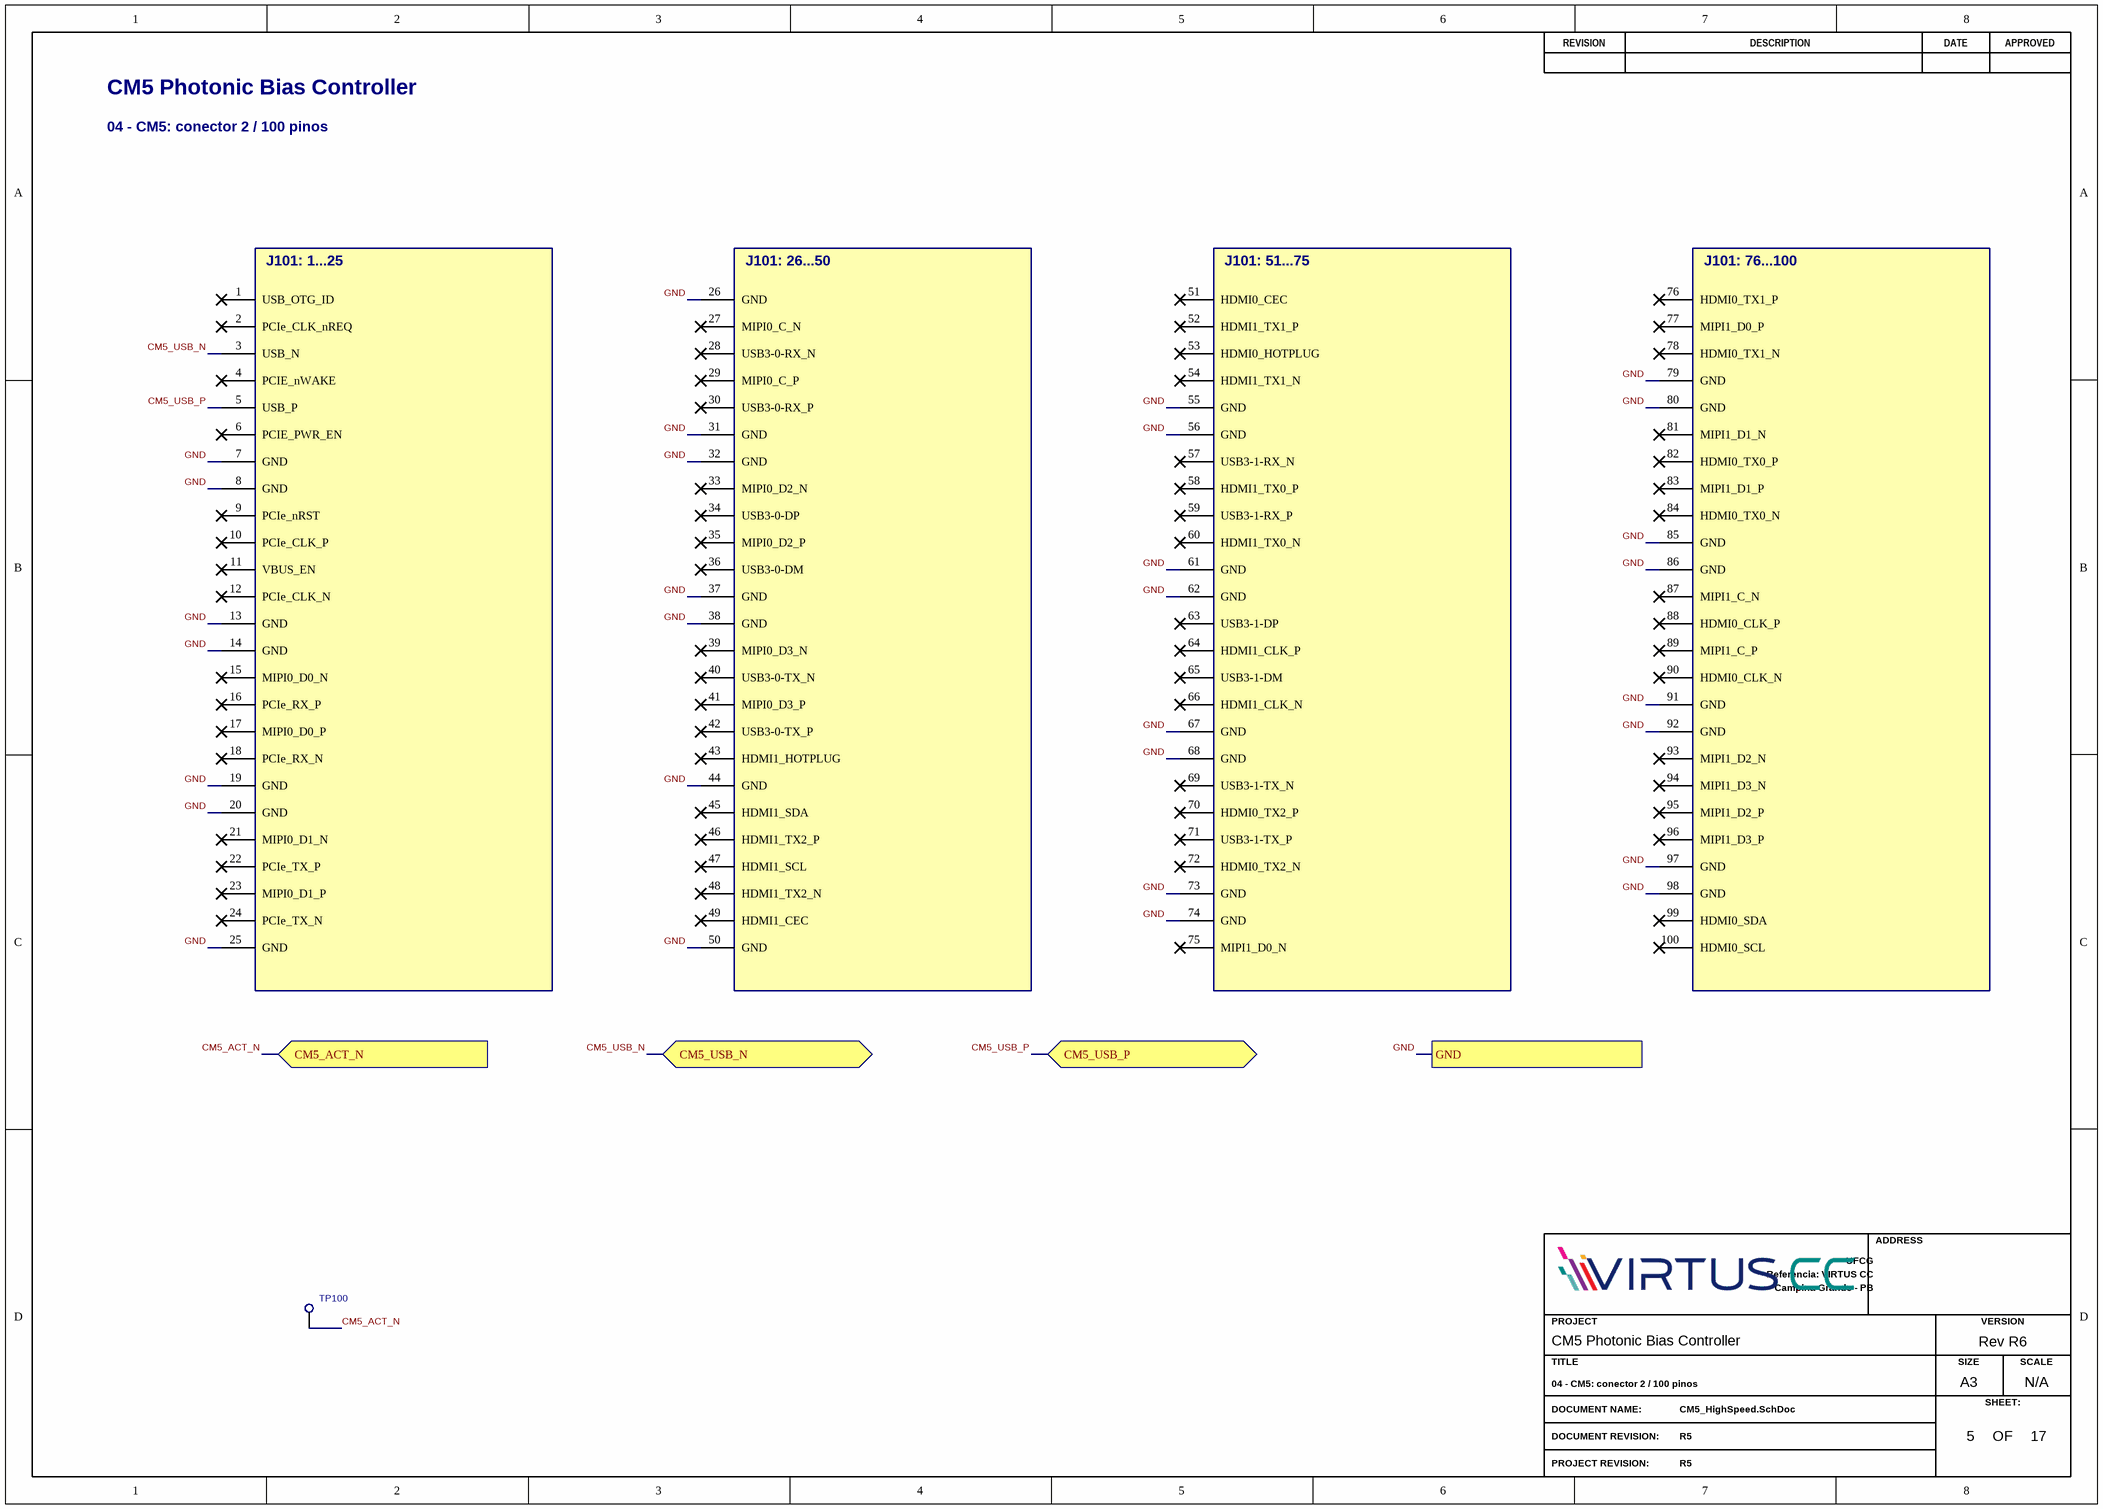
[diagram p7: CM5_HighSpeed.SchDoc]

### Parts
J101  CM5 carrier / 100 vias  [CM5_BERG100]  (value not drawn)
TP100  Testpoint  [TP06R]  (value not drawn)

### Ports
CM5_ACT_N (in), CM5_USB_N (bidir), CM5_USB_P (bidir), GND

### Nets
GND: J101.7(GND) J101.8(GND) J101.13(GND) J101.14(GND) J101.19(GND) J101.20(GND) J101.25(GND) J101.26(GND) J101.31(GND) J101.32(GND) J101.37(GND) J101.38(GND) J101.44(GND) J101.50(GND) J101.55(GND) J101.56(GND) J101.61(GND) J101.62(GND) J101.67(GND) J101.68(GND) J101.73(GND) J101.74(GND) J101.79(GND) J101.80(GND) J101.85(GND) J101.86(GND) J101.91(GND) J101.92(GND) J101.97(GND) J101.98(GND) ; port GND
CM5_ACT_N: TP100.1(TP) ; port CM5_ACT_N
CM5_USB_N: J101.3(USB_N) ; port CM5_USB_N
CM5_USB_P: J101.5(USB_P) ; port CM5_USB_P

Not connected (* = marked no-connect by the designer): J101 1(USB_OTG_ID)* 2(PCIe_CLK_nREQ)* 4(PCIE_nWAKE)* 6(PCIE_PWR_EN)* 9(PCIe_nRST)* 10(PCIe_CLK_P)* 11(VBUS_EN)* 12(PCIe_CLK_N)* 15(MIPI0_D0_N)* 16(PCIe_RX_P)* 17(MIPI0_D0_P)* 18(PCIe_RX_N)* 21(MIPI0_D1_N)* 22(PCIe_TX_P)* 23(MIPI0_D1_P)* 24(PCIe_TX_N)* 27(MIPI0_C_N)* 28(USB3-0-RX_N)* 29(MIPI0_C_P)* 30(USB3-0-RX_P)* 33(MIPI0_D2_N)* 34(USB3-0-DP)* 35(MIPI0_D2_P)* 36(USB3-0-DM)* 39(MIPI0_D3_N)* 40(USB3-0-TX_N)* 41(MIPI0_D3_P)* 42(USB3-0-TX_P)* 43(HDMI1_HOTPLUG)* 45(HDMI1_SDA)* 46(HDMI1_TX2_P)* 47(HDMI1_SCL)* 48(HDMI1_TX2_N)* 49(HDMI1_CEC)* 51(HDMI0_CEC)* 52(HDMI1_TX1_P)* 53(HDMI0_HOTPLUG)* 54(HDMI1_TX1_N)* 57(USB3-1-RX_N)* 58(HDMI1_TX0_P)* 59(USB3-1-RX_P)* 60(HDMI1_TX0_N)* 63(USB3-1-DP)* 64(HDMI1_CLK_P)* 65(USB3-1-DM)* 66(HDMI1_CLK_N)* 69(USB3-1-TX_N)* 70(HDMI0_TX2_P)* 71(USB3-1-TX_P)* 72(HDMI0_TX2_N)* 75(MIPI1_D0_N)* 76(HDMI0_TX1_P)* 77(MIPI1_D0_P)* 78(HDMI0_TX1_N)* 81(MIPI1_D1_N)* 82(HDMI0_TX0_P)* 83(MIPI1_D1_P)* 84(HDMI0_TX0_N)* 87(MIPI1_C_N)* 88(HDMI0_CLK_P)* 89(MIPI1_C_P)* 90(HDMI0_CLK_N)* 93(MIPI1_D2_N)* 94(MIPI1_D3_N)* 95(MIPI1_D2_P)* 96(MIPI1_D3_P)* 99(HDMI0_SDA)* 100(HDMI0_SCL)*

### Notes on the sheet
- CM5 Photonic Bias Controller
- 04 - CM5: conector 2 / 100 pinos
- REVISION
- DESCRIPTION
- DATE
- APPROVED
- ADDRESS
- PROJECT
- VERSION
- TITLE
- A3
- SIZE
- SCALE
- DOCUMENT NAME:
- DOCUMENT REVISION:
- OF
- SHEET:
- PROJECT REVISION:
- (in symbol CM5 carrier) J101: 1...25; J101: 26...50; J101: 51...75; J101: 76...100

### Library data of the parts
J101 = CM5 carrier: as J100 on sheet CM5_GPIO; Manufacturer 1: Amphenol Communications Solutions; Manufacturer Part Number 1: 10164227-1004A1RLF; Supplier 1: DigiKey; Supplier URL 1: https://www.digikey.com.br/pt/products/result?keywords=10164227-1004A1RLF; Supplier 2: Mouser; Supplier URL 2: https://br.mouser.com/c/?q=10164227-1004A1RLF; Datasheet: https://cdn.amphenol-cs.com/media/wysiwyg/files/drawing/10164227.pdf
TP100 = Testpoint: Review: Testpoint em cobre; excluido da BOM de compra.; Procurement Status: Recurso de cobre da PCB; nao comprar; BOM Purchase: No - PCB feature